# EasyEDA Pro project SOP100E 2025.05.27.eprj, schematic Schematic1, sheets 7 to 12 of 12

## Sheets
7 P7: Page Name: P7; Update Date: 2026-01-16
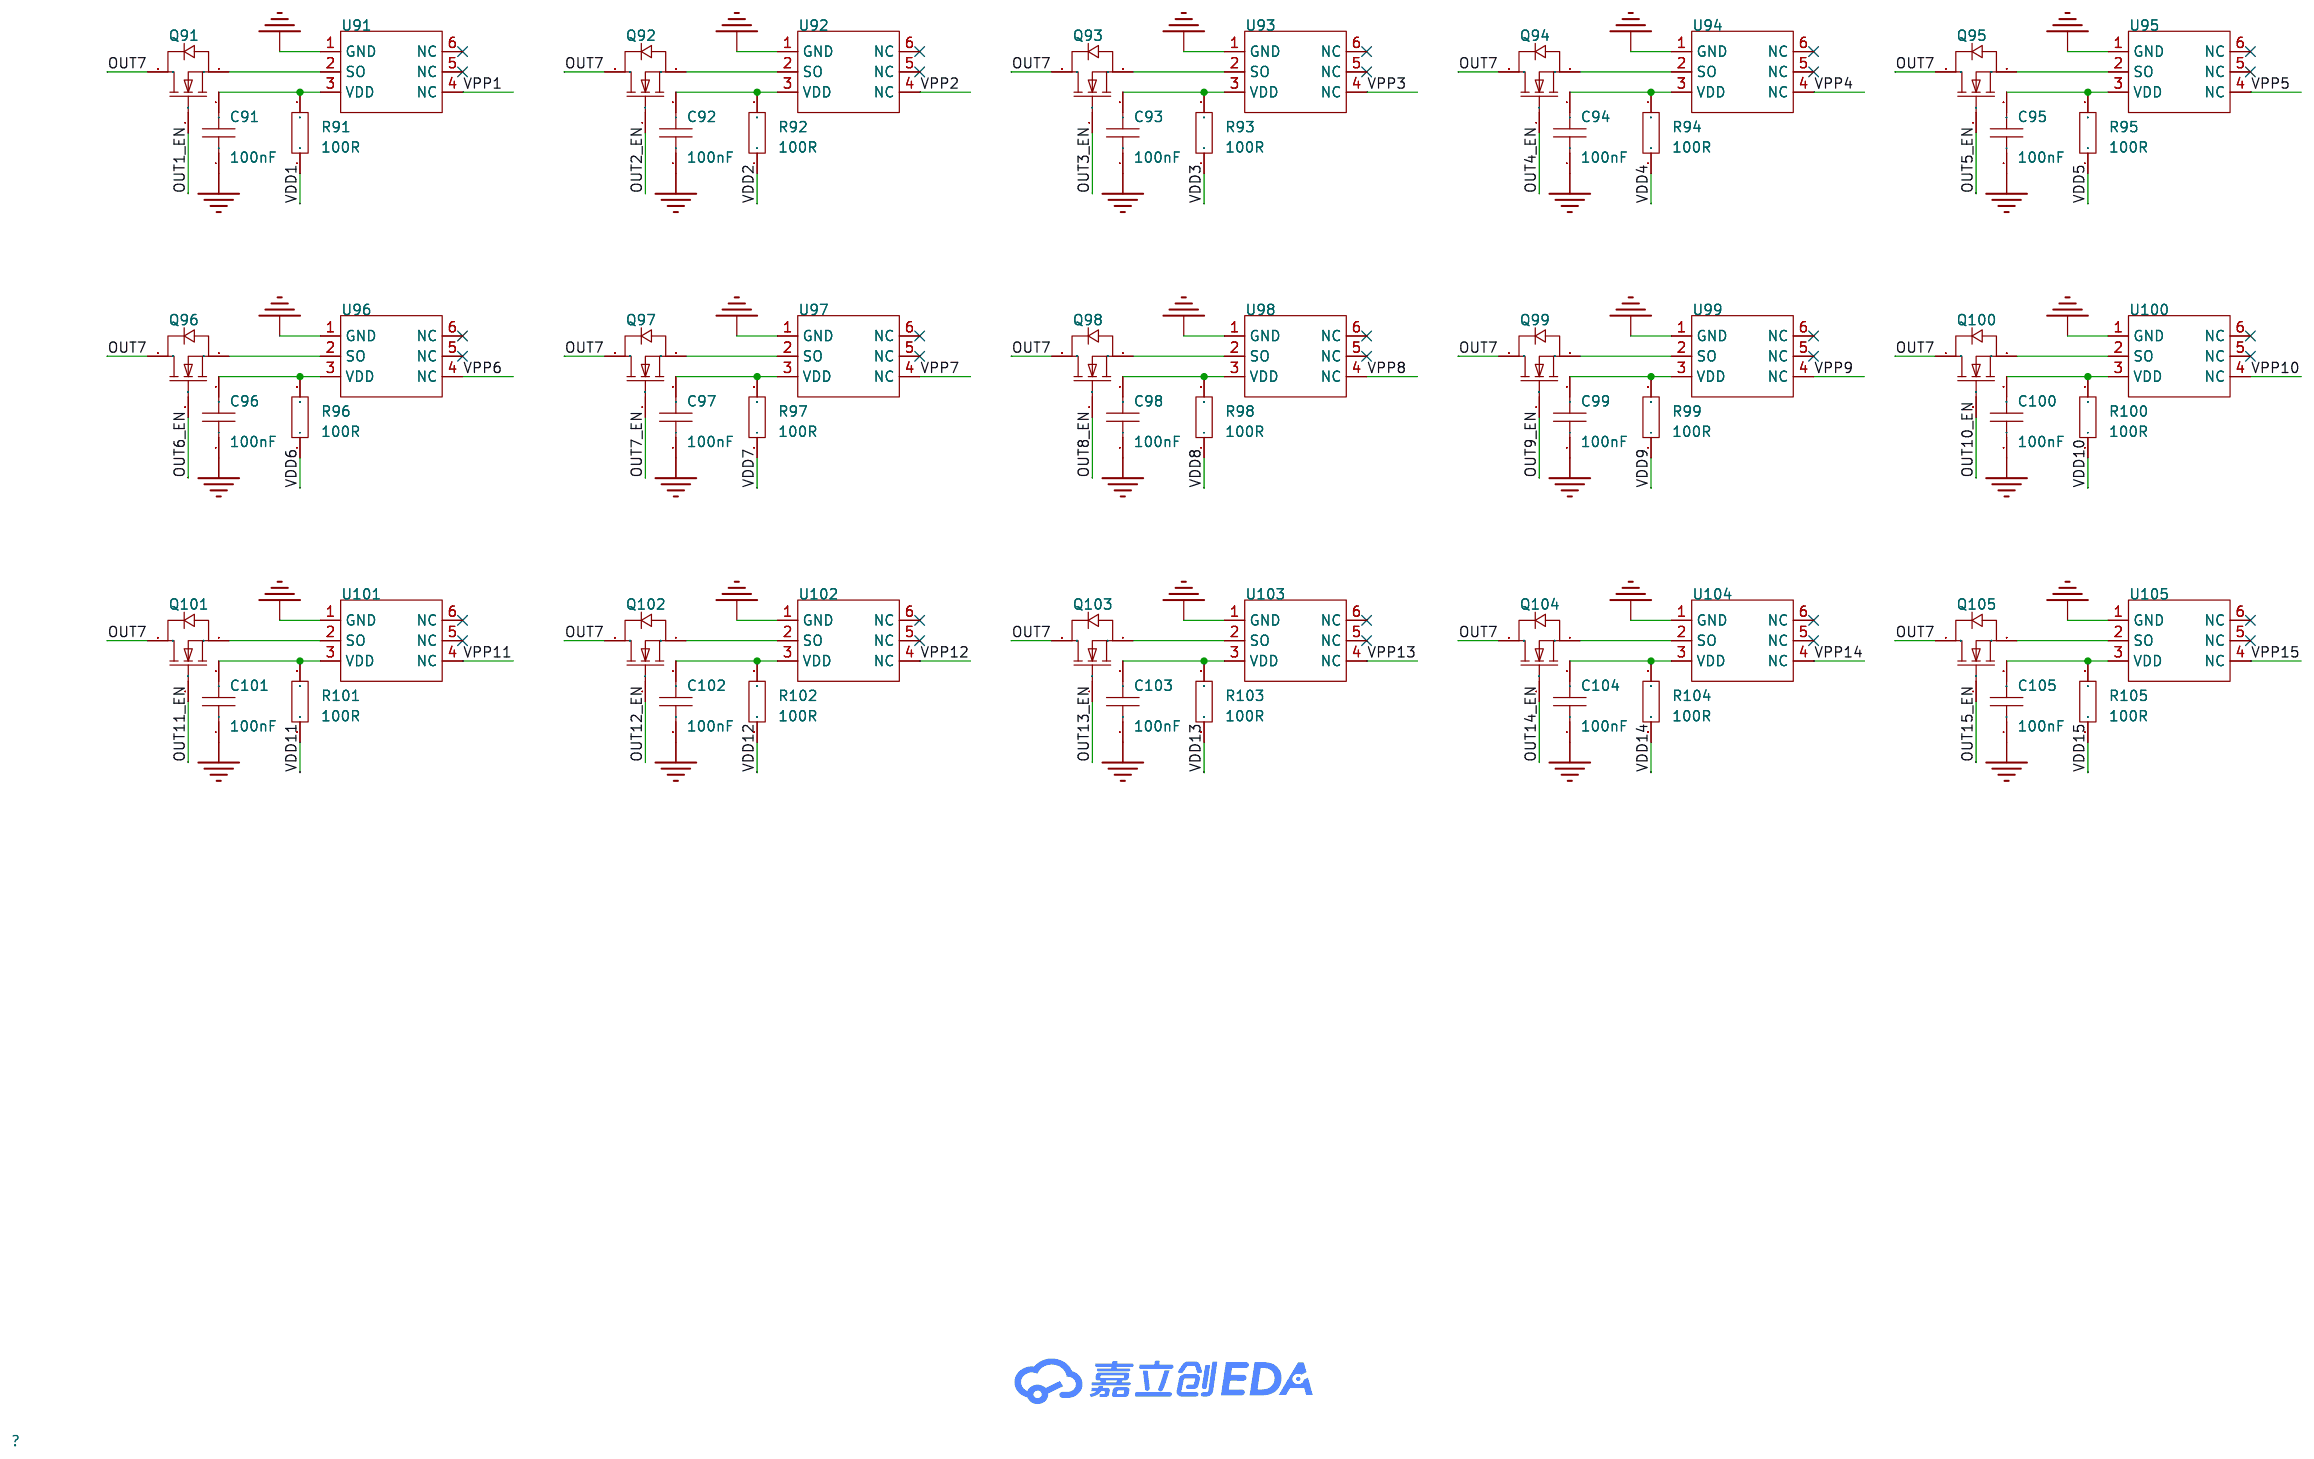
[diagram p6: P7]
8 P12: Create Date: 2026-01-15; Page Name: P12
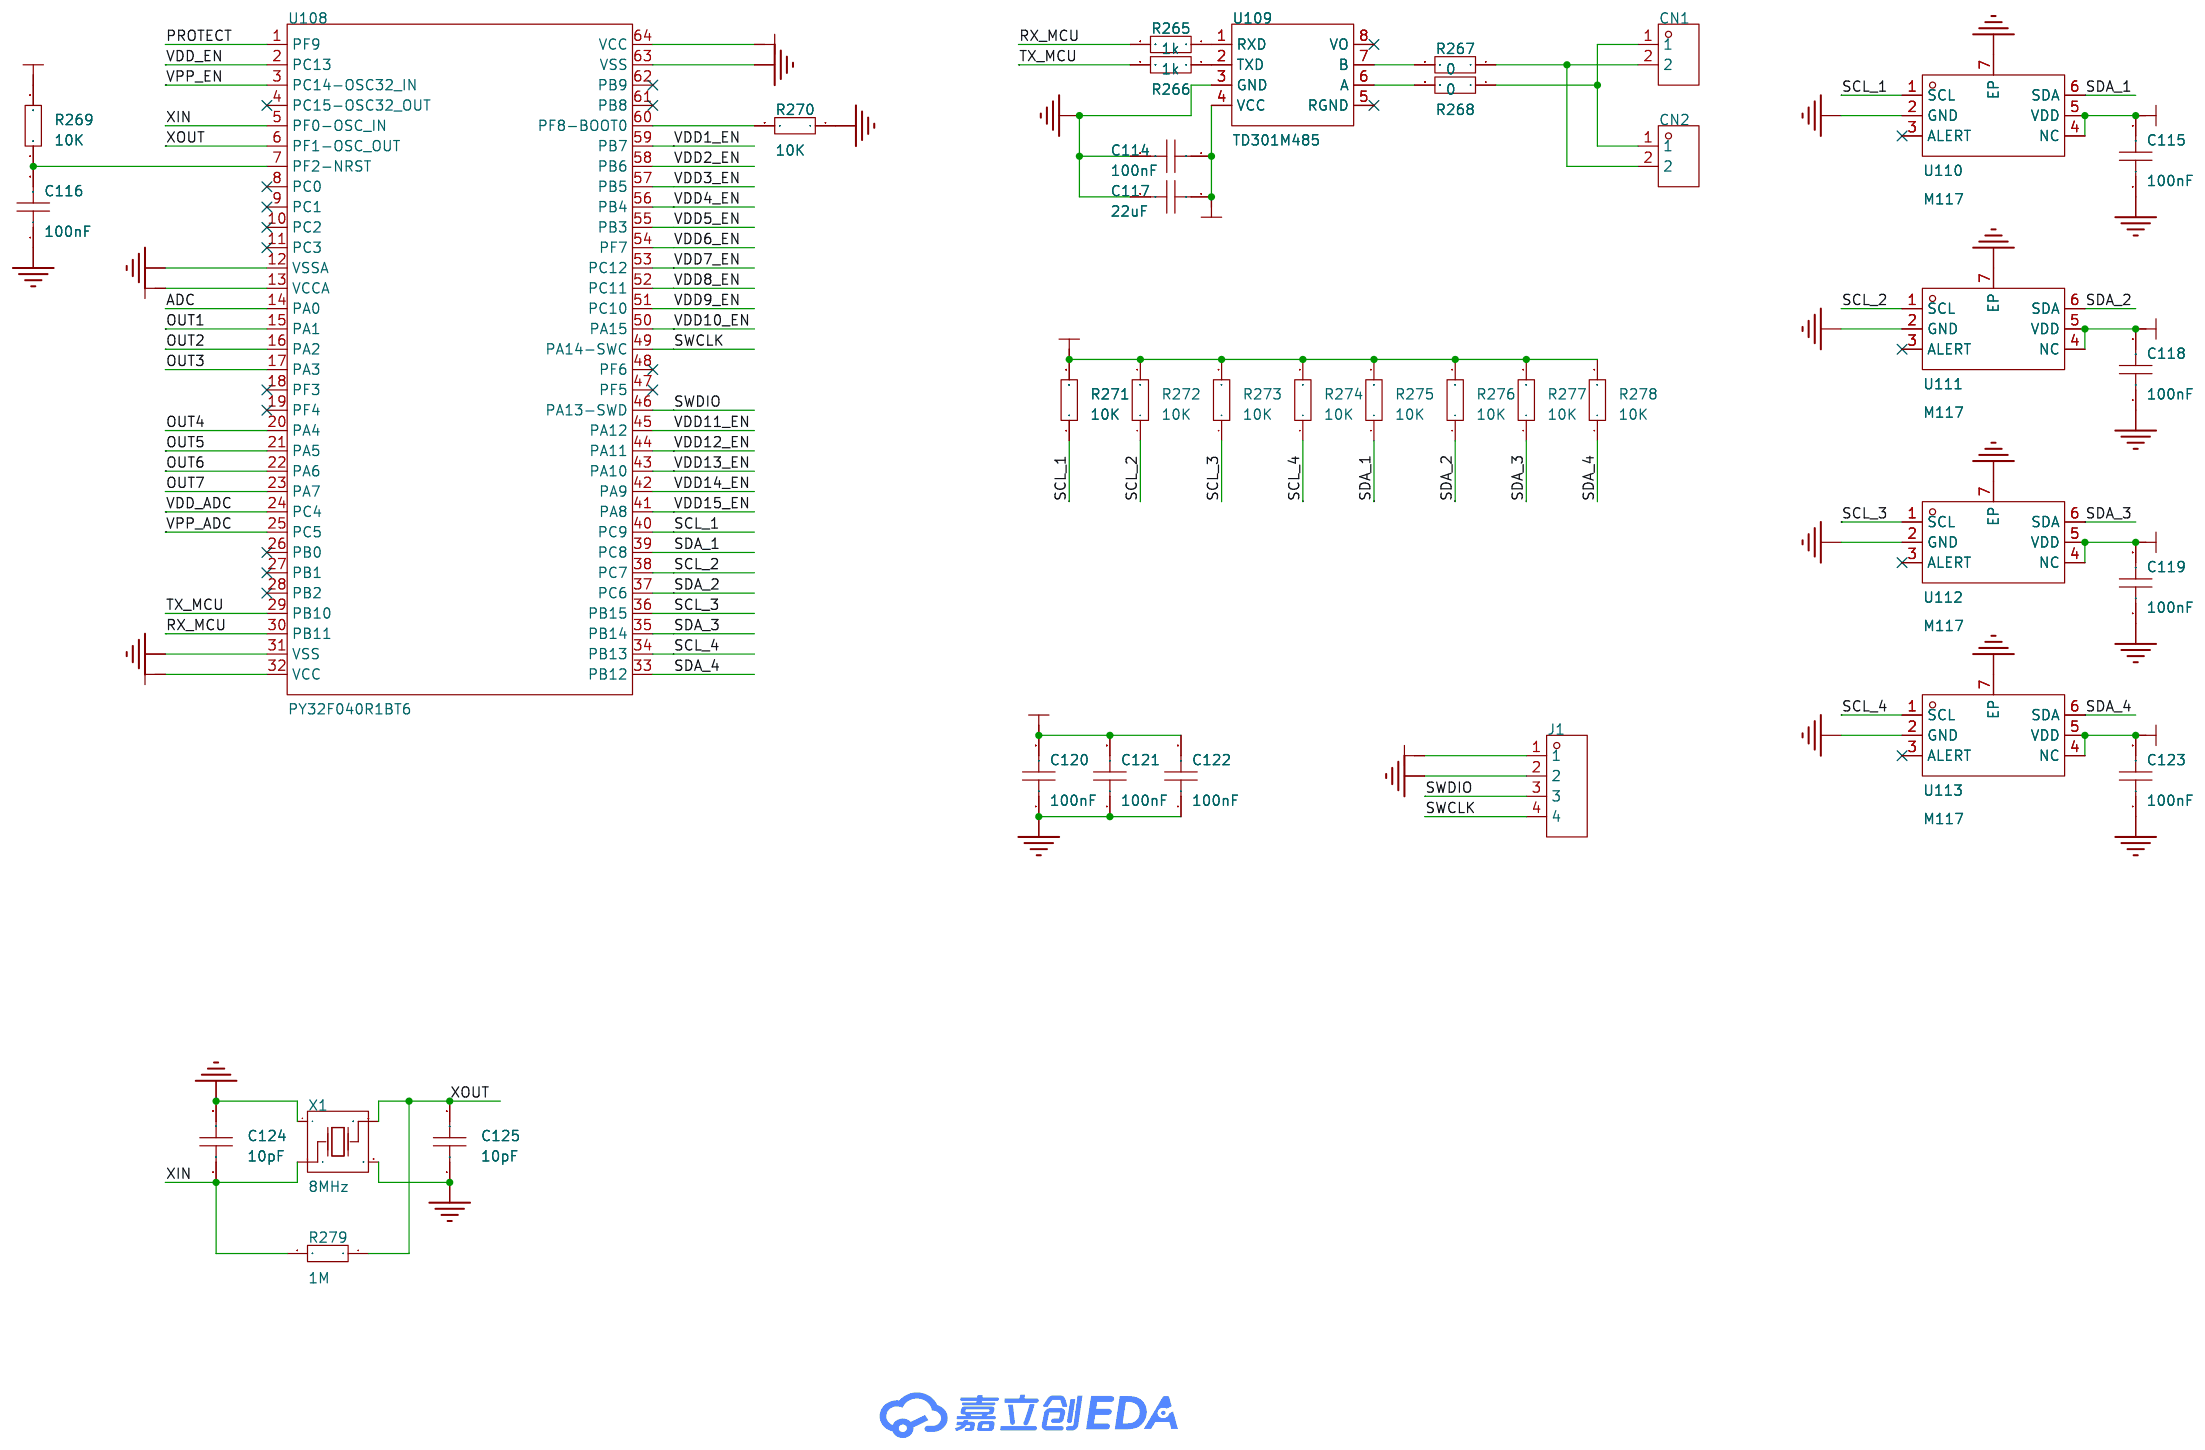
[diagram p7: P12]
9 P11: Create Date: 2026-01-15; Page Name: P11
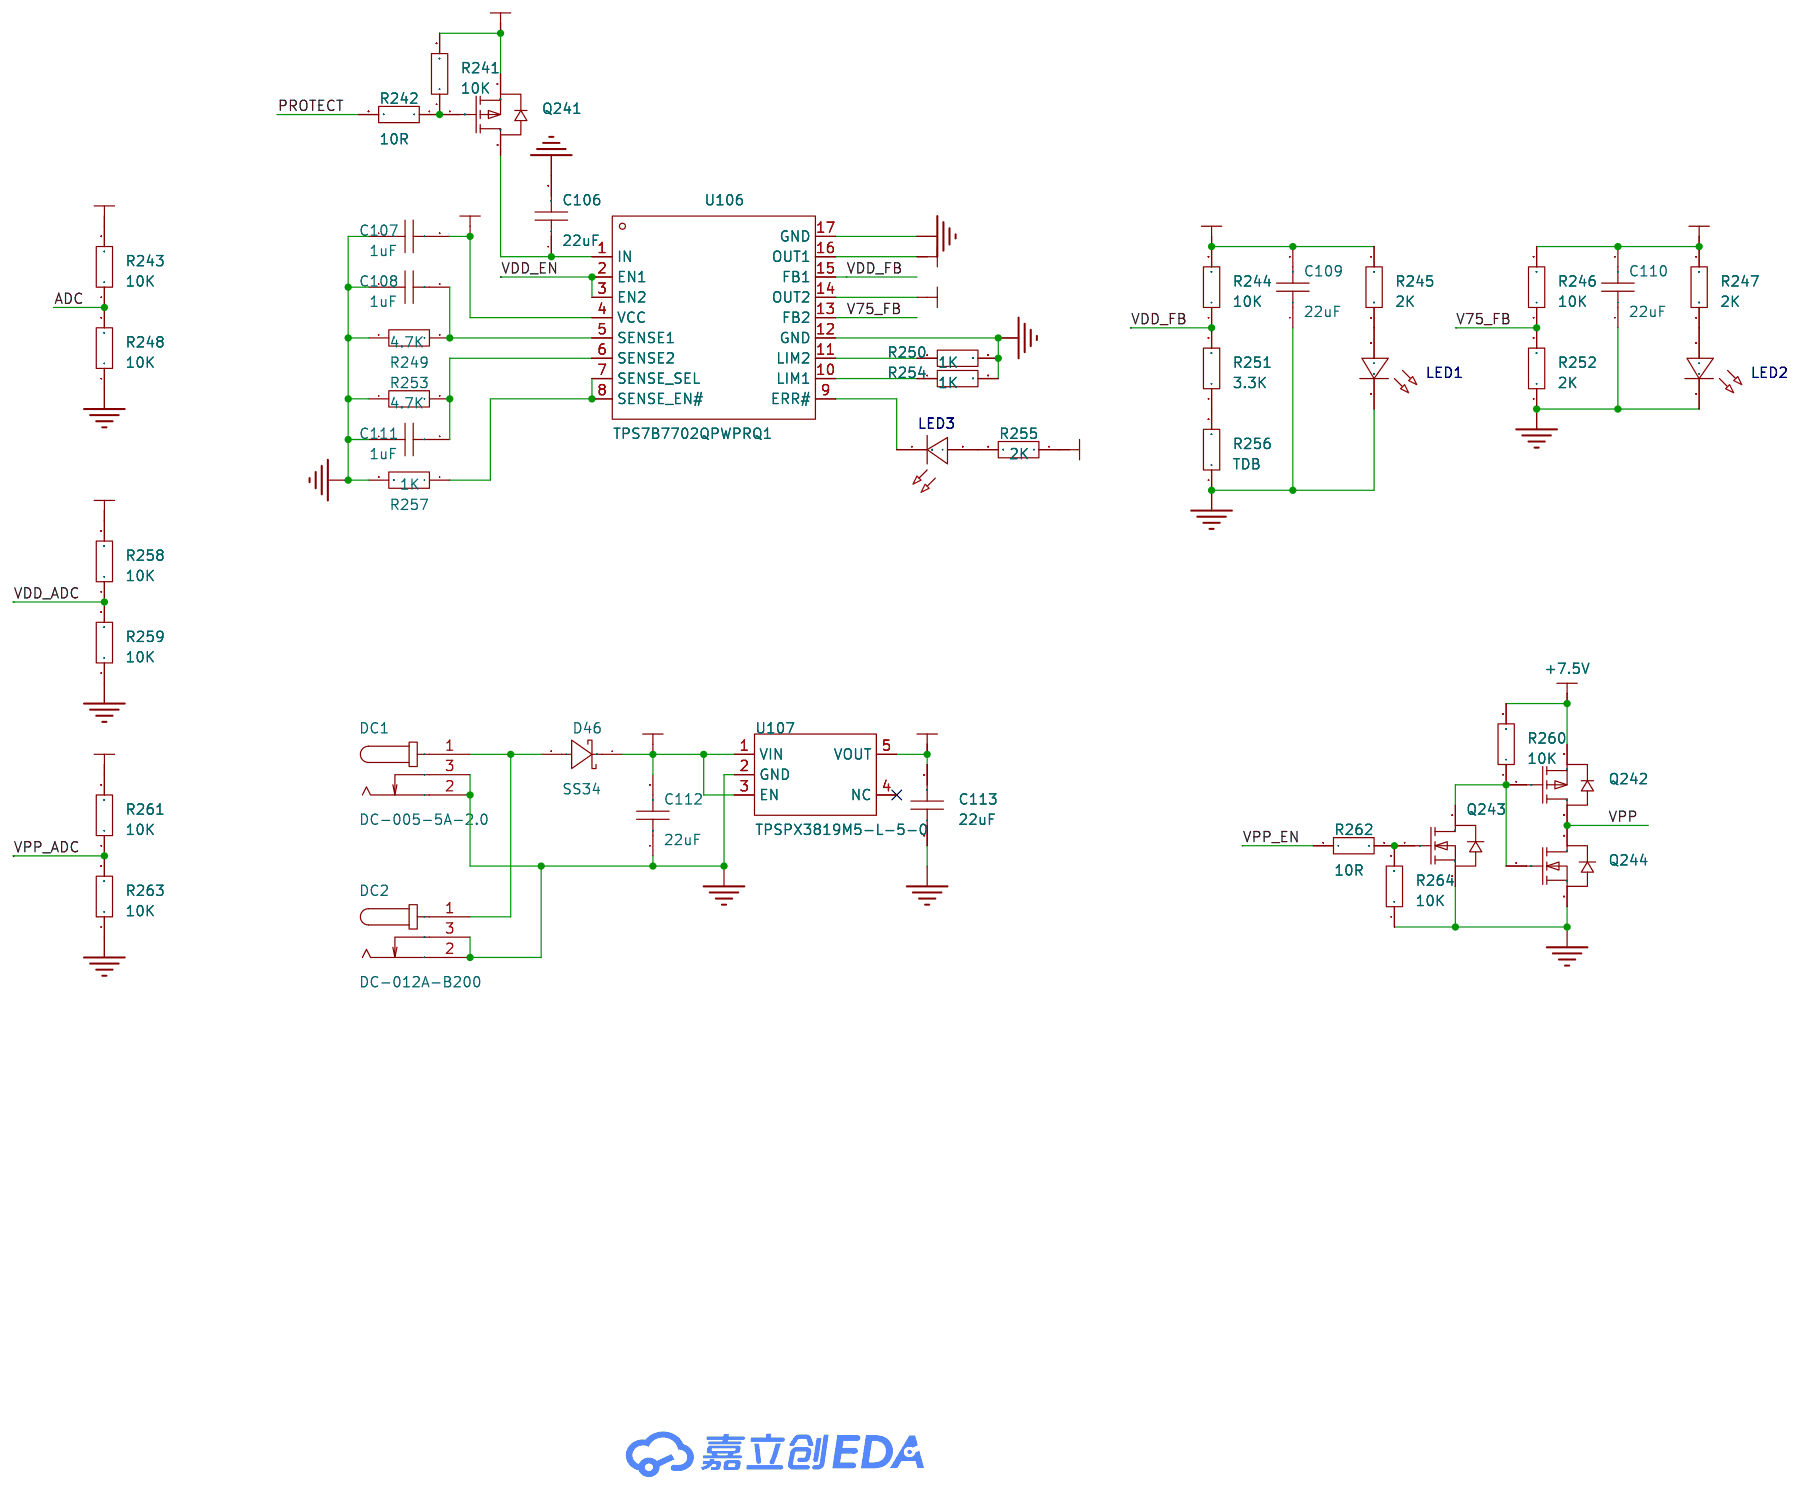
[diagram p8: P11]
10 P8: Create Date: 2026-01-15; Page Name: P8
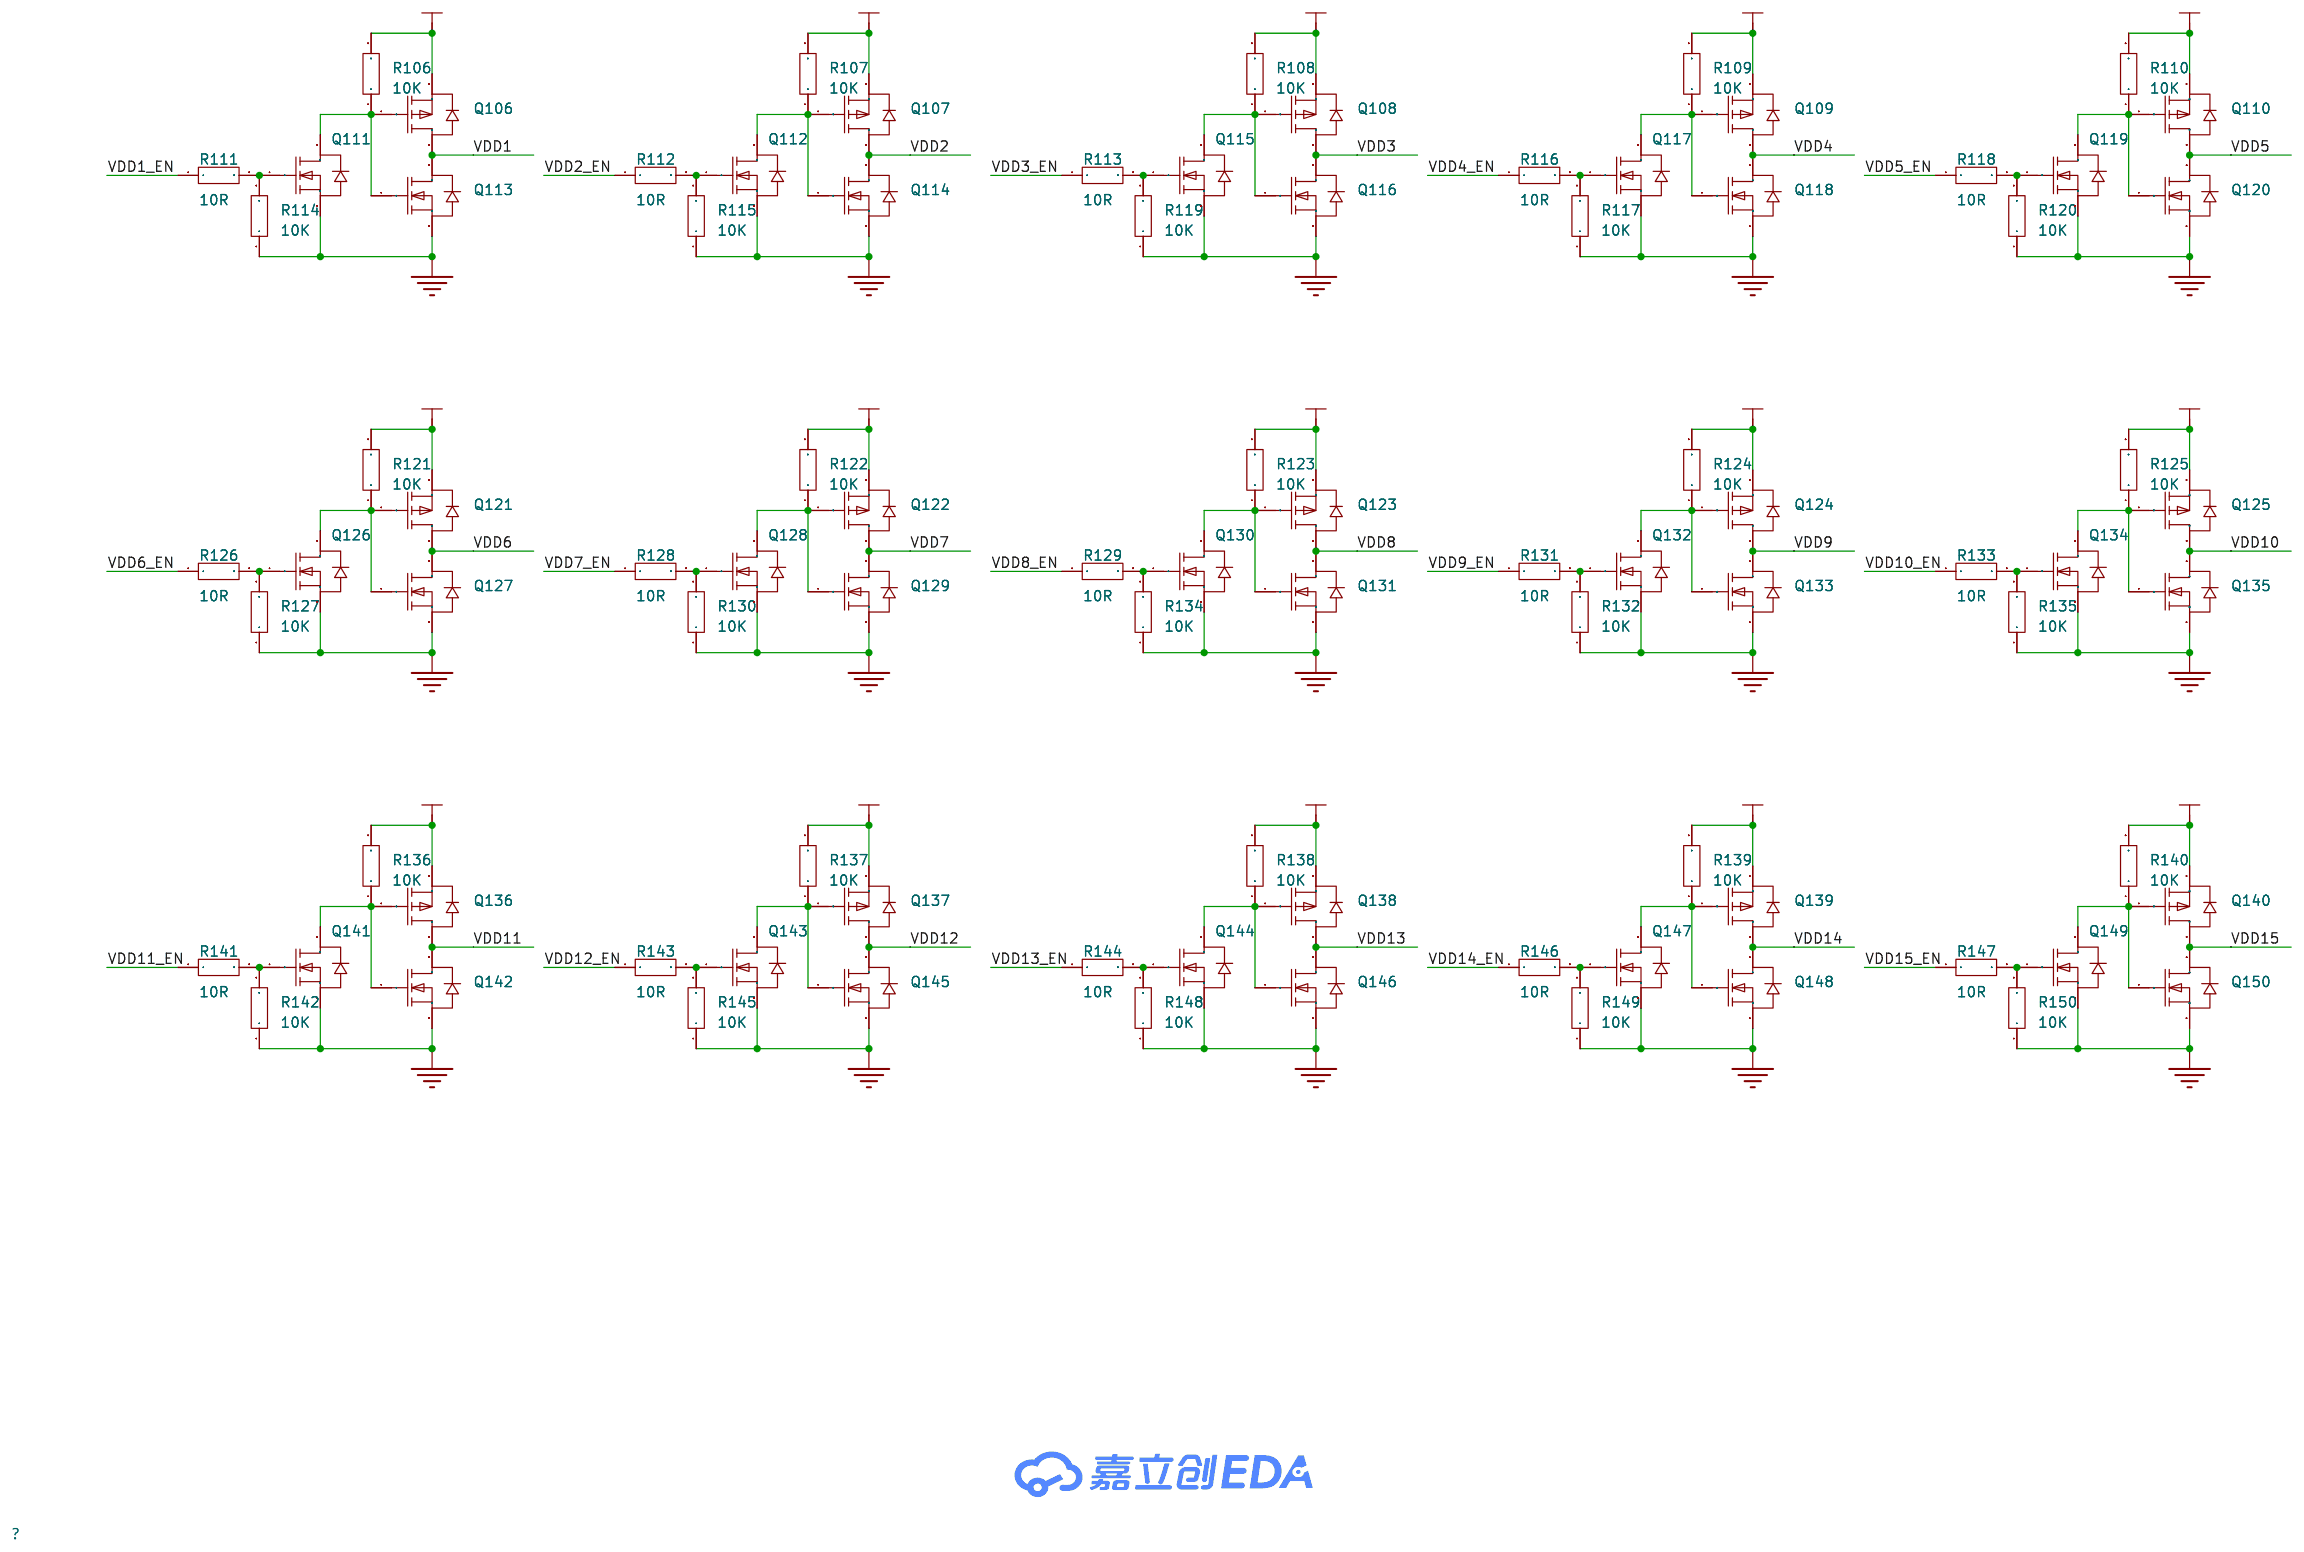
[diagram p9: P8]
11 P9: Create Date: 2026-01-16; Page Name: P9
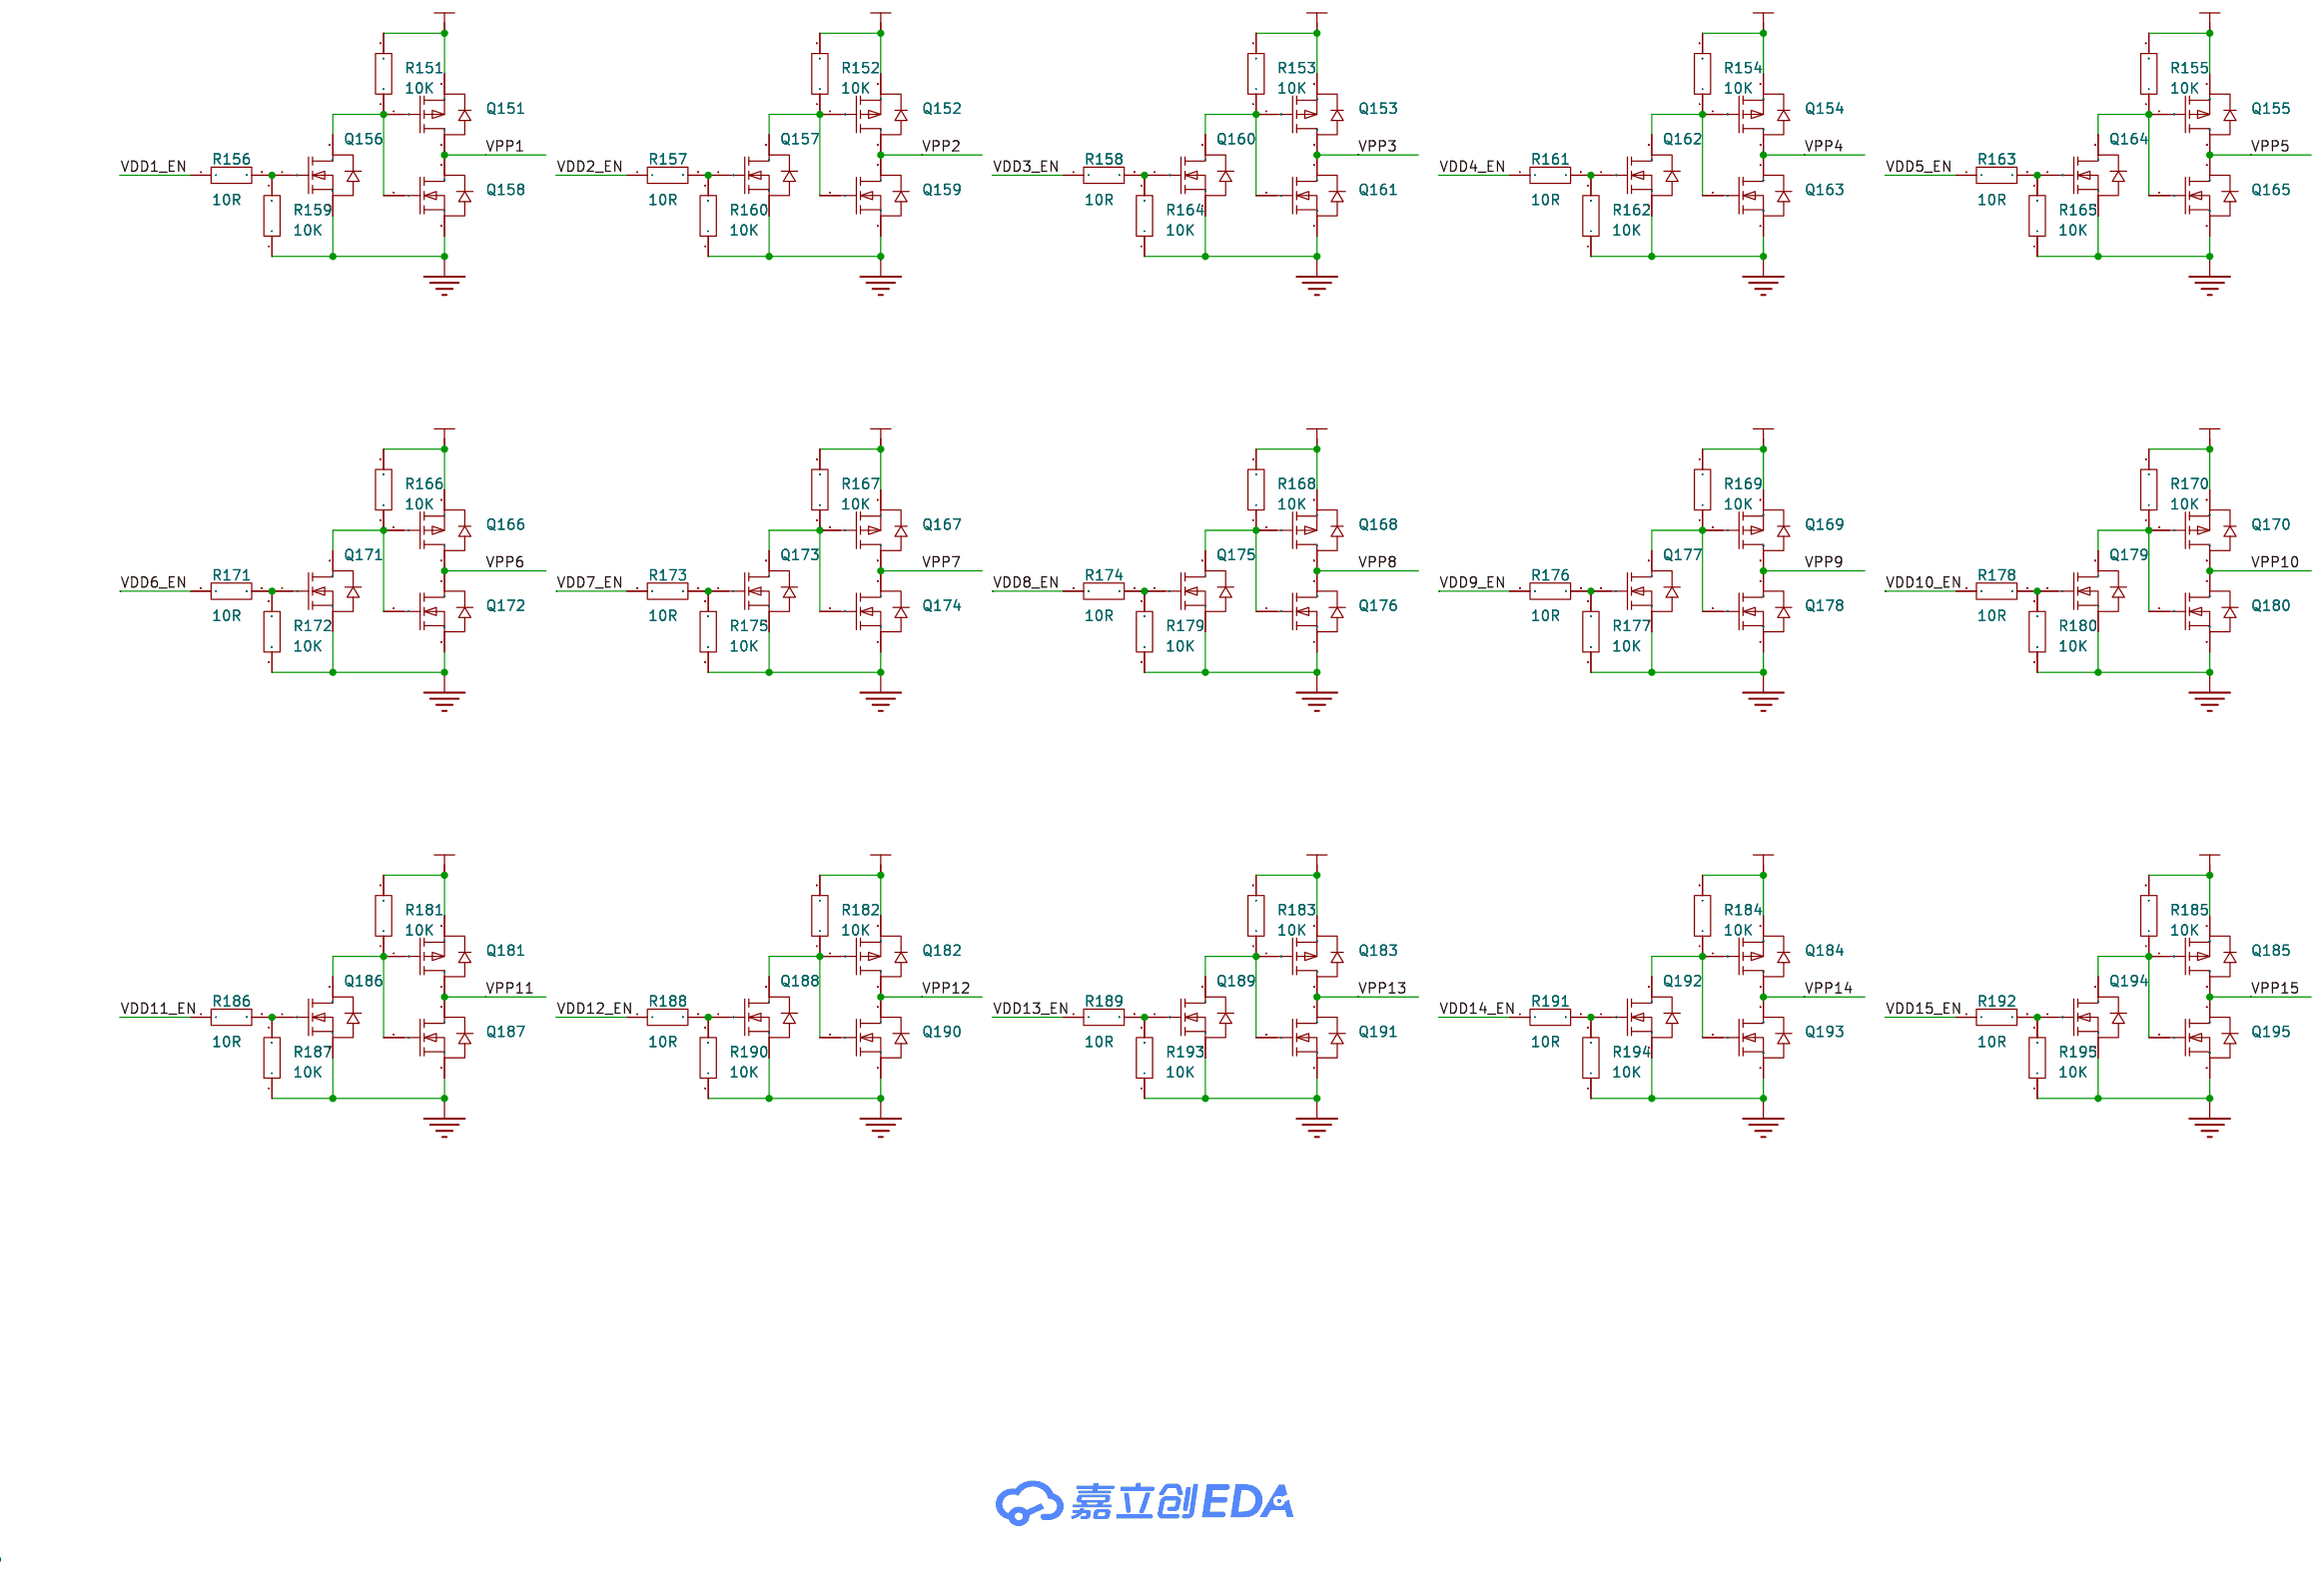
[diagram p10: P9]
12 P10: Create Date: 2026-01-16; Page Name: P10
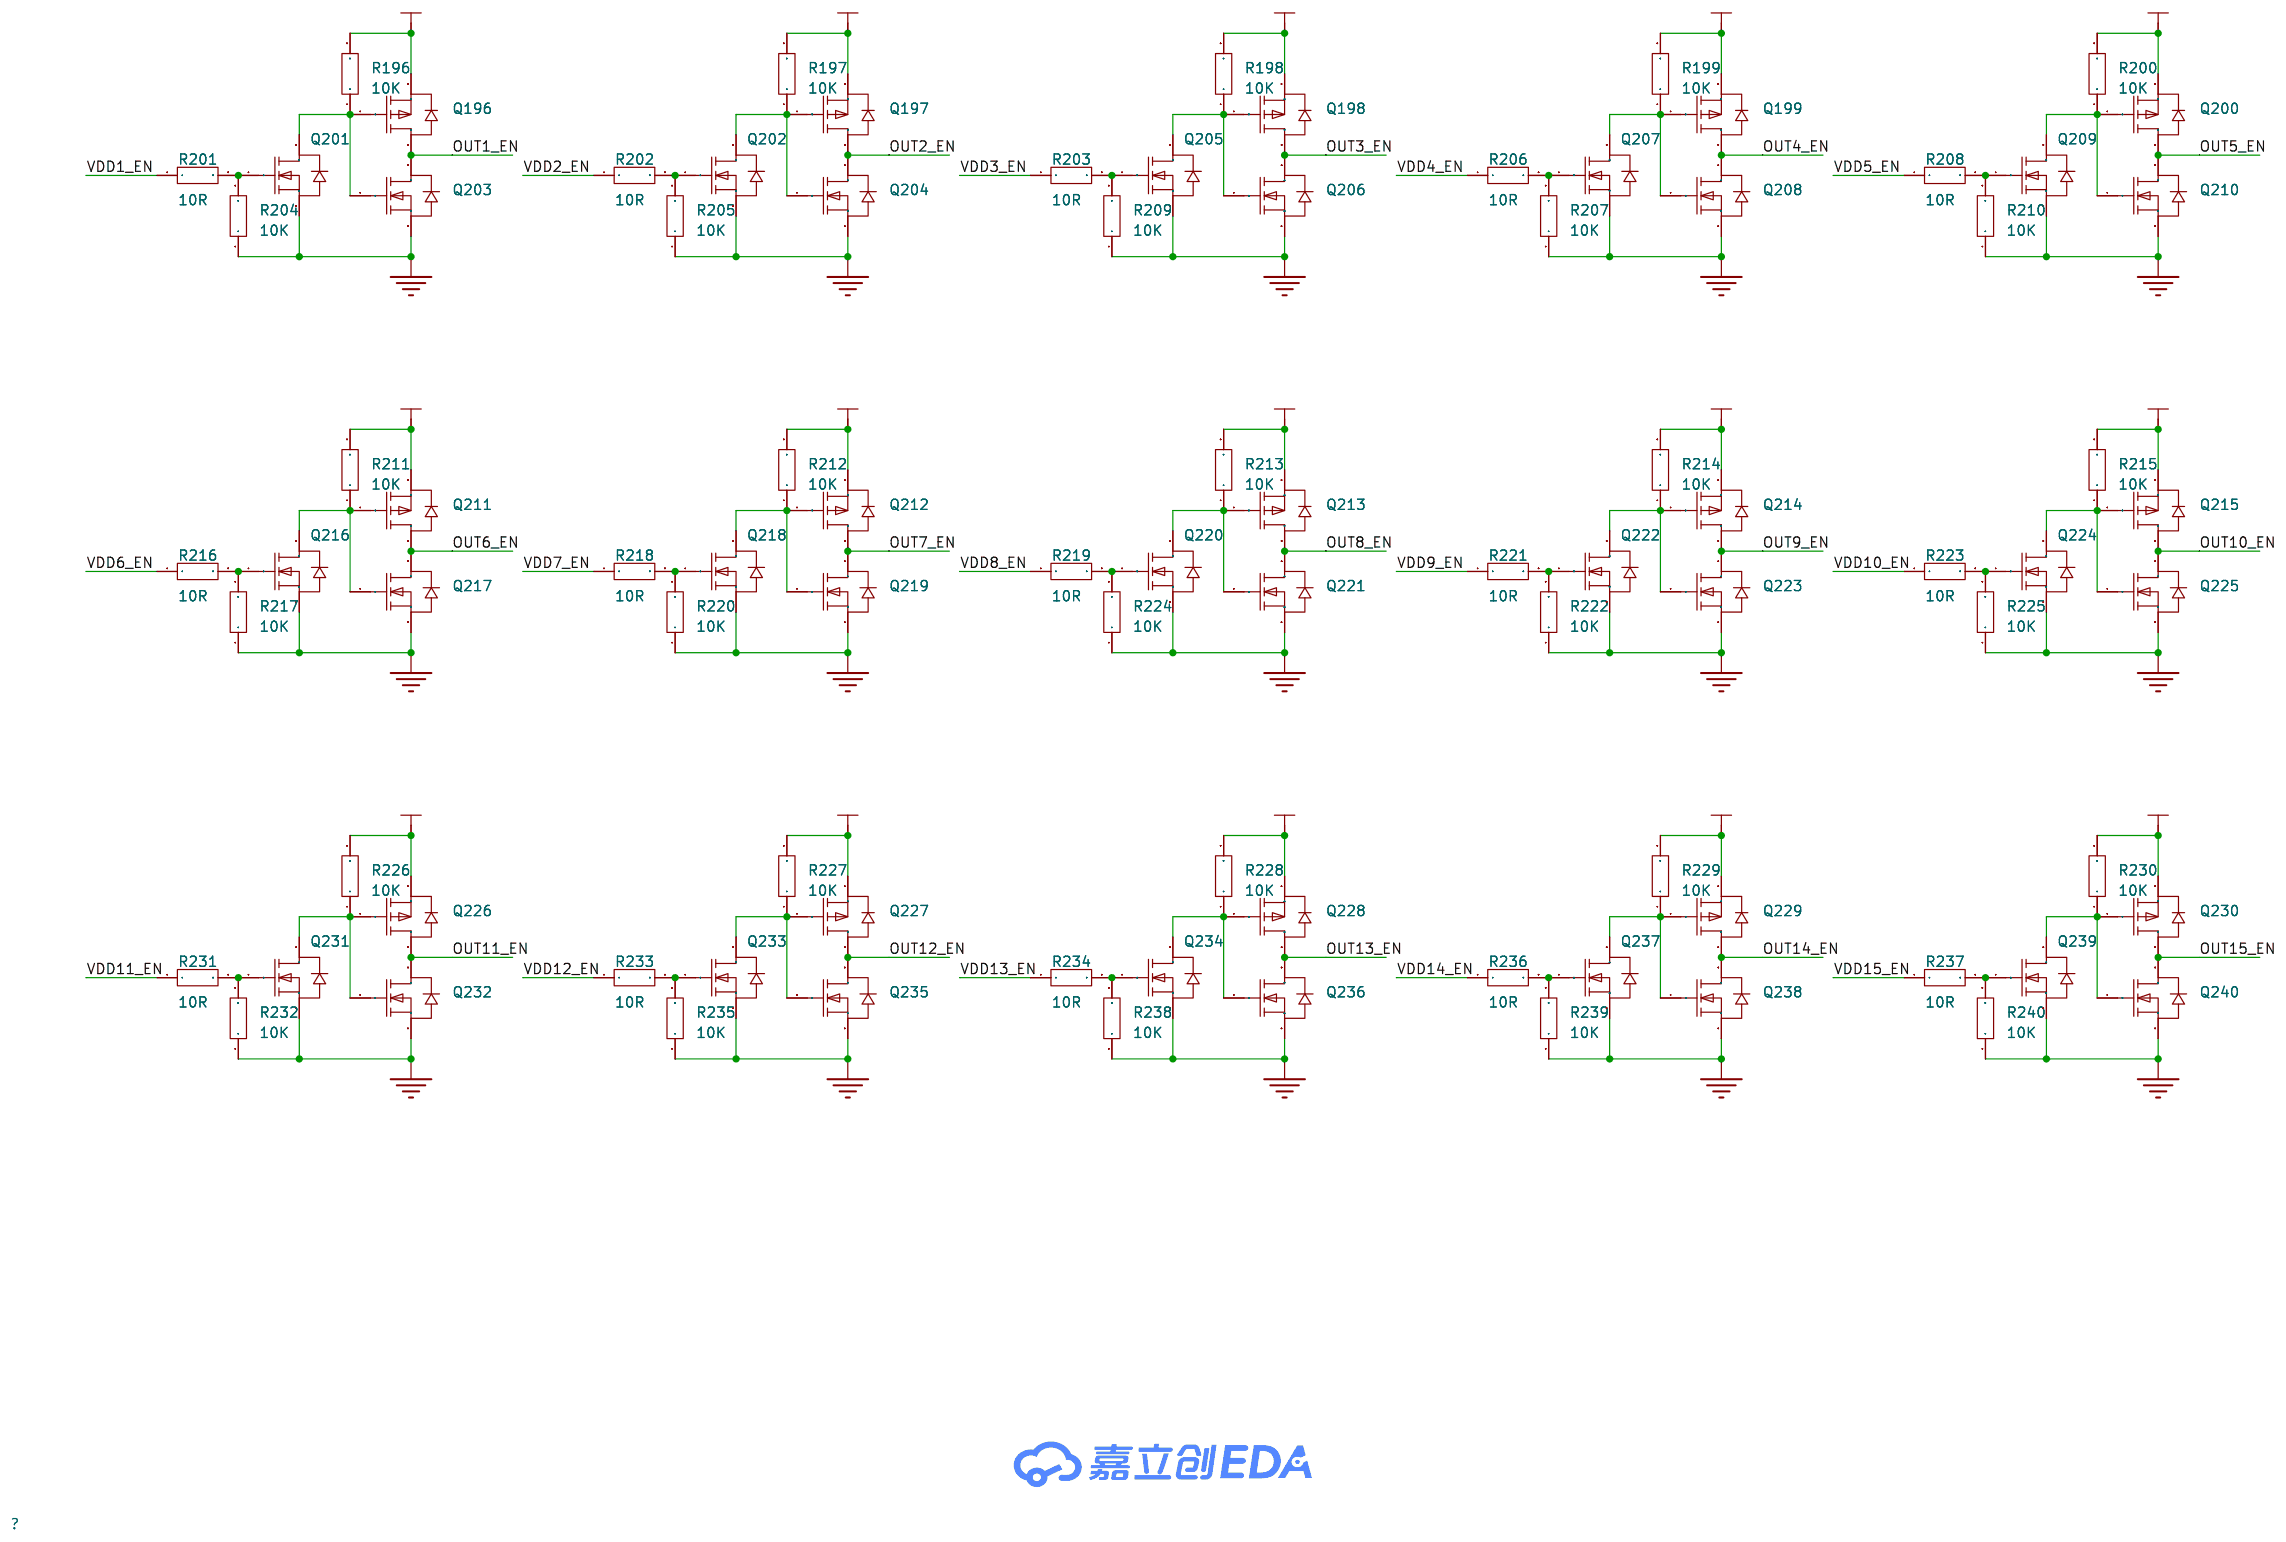
[diagram p11: P10]

## Parts
sheet P7
C91  100nF  [C0603]
C92  100nF  [C0603]
C93  100nF  [C0603]
C94  100nF  [C0603]
C95  100nF  [C0603]
C96  100nF  [C0603]
C97  100nF  [C0603]
C98  100nF  [C0603]
C99  100nF  [C0603]
C100  100nF  [C0603]
C101  100nF  [C0603]
C102  100nF  [C0603]
C103  100nF  [C0603]
C104  100nF  [C0603]
C105  100nF  [C0603]
Q91  AO3400A  [SOT-23-3_L2.9-W1.3-P1.90-LS2.4-BR]
Q92  AO3400A  [SOT-23-3_L2.9-W1.3-P1.90-LS2.4-BR]
Q93  AO3400A  [SOT-23-3_L2.9-W1.3-P1.90-LS2.4-BR]
Q94  AO3400A  [SOT-23-3_L2.9-W1.3-P1.90-LS2.4-BR]
Q95  AO3400A  [SOT-23-3_L2.9-W1.3-P1.90-LS2.4-BR]
Q96  AO3400A  [SOT-23-3_L2.9-W1.3-P1.90-LS2.4-BR]
Q97  AO3400A  [SOT-23-3_L2.9-W1.3-P1.90-LS2.4-BR]
Q98  AO3400A  [SOT-23-3_L2.9-W1.3-P1.90-LS2.4-BR]
Q99  AO3400A  [SOT-23-3_L2.9-W1.3-P1.90-LS2.4-BR]
Q100  AO3400A  [SOT-23-3_L2.9-W1.3-P1.90-LS2.4-BR]
Q101  AO3400A  [SOT-23-3_L2.9-W1.3-P1.90-LS2.4-BR]
Q102  AO3400A  [SOT-23-3_L2.9-W1.3-P1.90-LS2.4-BR]
Q103  AO3400A  [SOT-23-3_L2.9-W1.3-P1.90-LS2.4-BR]
Q104  AO3400A  [SOT-23-3_L2.9-W1.3-P1.90-LS2.4-BR]
Q105  AO3400A  [SOT-23-3_L2.9-W1.3-P1.90-LS2.4-BR]
R91  100R  [R0603]
R92  100R  [R0603]
R93  100R  [R0603]
R94  100R  [R0603]
R95  100R  [R0603]
R96  100R  [R0603]
R97  100R  [R0603]
R98  100R  [R0603]
R99  100R  [R0603]
R100  100R  [R0603]
R101  100R  [R0603]
R102  100R  [R0603]
R103  100R  [R0603]
R104  100R  [R0603]
R105  100R  [R0603]
U91  WF100E 1BG S6 DA 0.5P4.5 AT  [SOP-6_L7.0-W7.0-P2.54-LS10.3-TL-CW]
U92  WF100E 1BG S6 DA 0.5P4.5 AT  [SOP-6_L7.0-W7.0-P2.54-LS10.3-TL-CW]
U93  WF100E 1BG S6 DA 0.5P4.5 AT  [SOP-6_L7.0-W7.0-P2.54-LS10.3-TL-CW]
U94  WF100E 1BG S6 DA 0.5P4.5 AT  [SOP-6_L7.0-W7.0-P2.54-LS10.3-TL-CW]
U95  WF100E 1BG S6 DA 0.5P4.5 AT  [SOP-6_L7.0-W7.0-P2.54-LS10.3-TL-CW]
U96  WF100E 1BG S6 DA 0.5P4.5 AT  [SOP-6_L7.0-W7.0-P2.54-LS10.3-TL-CW]
U97  WF100E 1BG S6 DA 0.5P4.5 AT  [SOP-6_L7.0-W7.0-P2.54-LS10.3-TL-CW]
U98  WF100E 1BG S6 DA 0.5P4.5 AT  [SOP-6_L7.0-W7.0-P2.54-LS10.3-TL-CW]
U99  WF100E 1BG S6 DA 0.5P4.5 AT  [SOP-6_L7.0-W7.0-P2.54-LS10.3-TL-CW]
U100  WF100E 1BG S6 DA 0.5P4.5 AT  [SOP-6_L7.0-W7.0-P2.54-LS10.3-TL-CW]
U101  WF100E 1BG S6 DA 0.5P4.5 AT  [SOP-6_L7.0-W7.0-P2.54-LS10.3-TL-CW]
U102  WF100E 1BG S6 DA 0.5P4.5 AT  [SOP-6_L7.0-W7.0-P2.54-LS10.3-TL-CW]
U103  WF100E 1BG S6 DA 0.5P4.5 AT  [SOP-6_L7.0-W7.0-P2.54-LS10.3-TL-CW]
U104  WF100E 1BG S6 DA 0.5P4.5 AT  [SOP-6_L7.0-W7.0-P2.54-LS10.3-TL-CW]
U105  WF100E 1BG S6 DA 0.5P4.5 AT  [SOP-6_L7.0-W7.0-P2.54-LS10.3-TL-CW]
sheet P8
Q106  AO3401A  [SOT-23_L2.9-W1.3-P1.90-LS2.4-BR]
Q107  AO3401A  [SOT-23_L2.9-W1.3-P1.90-LS2.4-BR]
Q108  AO3401A  [SOT-23_L2.9-W1.3-P1.90-LS2.4-BR]
Q109  AO3401A  [SOT-23_L2.9-W1.3-P1.90-LS2.4-BR]
Q110  AO3401A  [SOT-23_L2.9-W1.3-P1.90-LS2.4-BR]
Q111  AO3400A  [SOT-23-3_L2.9-W1.3-P1.90-LS2.4-BR]
Q112  AO3400A  [SOT-23-3_L2.9-W1.3-P1.90-LS2.4-BR]
Q113  AO3400A  [SOT-23-3_L2.9-W1.3-P1.90-LS2.4-BR]
Q114  AO3400A  [SOT-23-3_L2.9-W1.3-P1.90-LS2.4-BR]
Q115  AO3400A  [SOT-23-3_L2.9-W1.3-P1.90-LS2.4-BR]
Q116  AO3400A  [SOT-23-3_L2.9-W1.3-P1.90-LS2.4-BR]
Q117  AO3400A  [SOT-23-3_L2.9-W1.3-P1.90-LS2.4-BR]
Q118  AO3400A  [SOT-23-3_L2.9-W1.3-P1.90-LS2.4-BR]
Q119  AO3400A  [SOT-23-3_L2.9-W1.3-P1.90-LS2.4-BR]
Q120  AO3400A  [SOT-23-3_L2.9-W1.3-P1.90-LS2.4-BR]
Q121  AO3401A  [SOT-23_L2.9-W1.3-P1.90-LS2.4-BR]
Q122  AO3401A  [SOT-23_L2.9-W1.3-P1.90-LS2.4-BR]
Q123  AO3401A  [SOT-23_L2.9-W1.3-P1.90-LS2.4-BR]
Q124  AO3401A  [SOT-23_L2.9-W1.3-P1.90-LS2.4-BR]
Q125  AO3401A  [SOT-23_L2.9-W1.3-P1.90-LS2.4-BR]
Q126  AO3400A  [SOT-23-3_L2.9-W1.3-P1.90-LS2.4-BR]
Q127  AO3400A  [SOT-23-3_L2.9-W1.3-P1.90-LS2.4-BR]
Q128  AO3400A  [SOT-23-3_L2.9-W1.3-P1.90-LS2.4-BR]
Q129  AO3400A  [SOT-23-3_L2.9-W1.3-P1.90-LS2.4-BR]
Q130  AO3400A  [SOT-23-3_L2.9-W1.3-P1.90-LS2.4-BR]
Q131  AO3400A  [SOT-23-3_L2.9-W1.3-P1.90-LS2.4-BR]
Q132  AO3400A  [SOT-23-3_L2.9-W1.3-P1.90-LS2.4-BR]
Q133  AO3400A  [SOT-23-3_L2.9-W1.3-P1.90-LS2.4-BR]
Q134  AO3400A  [SOT-23-3_L2.9-W1.3-P1.90-LS2.4-BR]
Q135  AO3400A  [SOT-23-3_L2.9-W1.3-P1.90-LS2.4-BR]
Q136  AO3401A  [SOT-23_L2.9-W1.3-P1.90-LS2.4-BR]
Q137  AO3401A  [SOT-23_L2.9-W1.3-P1.90-LS2.4-BR]
Q138  AO3401A  [SOT-23_L2.9-W1.3-P1.90-LS2.4-BR]
Q139  AO3401A  [SOT-23_L2.9-W1.3-P1.90-LS2.4-BR]
Q140  AO3401A  [SOT-23_L2.9-W1.3-P1.90-LS2.4-BR]
Q141  AO3400A  [SOT-23-3_L2.9-W1.3-P1.90-LS2.4-BR]
Q142  AO3400A  [SOT-23-3_L2.9-W1.3-P1.90-LS2.4-BR]
Q143  AO3400A  [SOT-23-3_L2.9-W1.3-P1.90-LS2.4-BR]
Q144  AO3400A  [SOT-23-3_L2.9-W1.3-P1.90-LS2.4-BR]
Q145  AO3400A  [SOT-23-3_L2.9-W1.3-P1.90-LS2.4-BR]
Q146  AO3400A  [SOT-23-3_L2.9-W1.3-P1.90-LS2.4-BR]
Q147  AO3400A  [SOT-23-3_L2.9-W1.3-P1.90-LS2.4-BR]
Q148  AO3400A  [SOT-23-3_L2.9-W1.3-P1.90-LS2.4-BR]
Q149  AO3400A  [SOT-23-3_L2.9-W1.3-P1.90-LS2.4-BR]
Q150  AO3400A  [SOT-23-3_L2.9-W1.3-P1.90-LS2.4-BR]
R106  10K  [R0603]
R107  10K  [R0603]
R108  10K  [R0603]
R109  10K  [R0603]
R110  10K  [R0603]
R111  10R  [R0603]
R112  10R  [R0603]
R113  10R  [R0603]
R114  10K  [R0603]
R115  10K  [R0603]
R116  10R  [R0603]
R117  10K  [R0603]
R118  10R  [R0603]
R119  10K  [R0603]
R120  10K  [R0603]
R121  10K  [R0603]
R122  10K  [R0603]
R123  10K  [R0603]
R124  10K  [R0603]
R125  10K  [R0603]
R126  10R  [R0603]
R127  10K  [R0603]
R128  10R  [R0603]
R129  10R  [R0603]
R130  10K  [R0603]
R131  10R  [R0603]
R132  10K  [R0603]
R133  10R  [R0603]
R134  10K  [R0603]
R135  10K  [R0603]
R136  10K  [R0603]
R137  10K  [R0603]
R138  10K  [R0603]
R139  10K  [R0603]
R140  10K  [R0603]
R141  10R  [R0603]
R142  10K  [R0603]
R143  10R  [R0603]
R144  10R  [R0603]
R145  10K  [R0603]
R146  10R  [R0603]
R147  10R  [R0603]
R148  10K  [R0603]
R149  10K  [R0603]
R150  10K  [R0603]
sheet P9
Q151  AO3401A  [SOT-23_L2.9-W1.3-P1.90-LS2.4-BR]
Q152  AO3401A  [SOT-23_L2.9-W1.3-P1.90-LS2.4-BR]
Q153  AO3401A  [SOT-23_L2.9-W1.3-P1.90-LS2.4-BR]
Q154  AO3401A  [SOT-23_L2.9-W1.3-P1.90-LS2.4-BR]
Q155  AO3401A  [SOT-23_L2.9-W1.3-P1.90-LS2.4-BR]
Q156  AO3400A  [SOT-23-3_L2.9-W1.3-P1.90-LS2.4-BR]
Q157  AO3400A  [SOT-23-3_L2.9-W1.3-P1.90-LS2.4-BR]
Q158  AO3400A  [SOT-23-3_L2.9-W1.3-P1.90-LS2.4-BR]
Q159  AO3400A  [SOT-23-3_L2.9-W1.3-P1.90-LS2.4-BR]
Q160  AO3400A  [SOT-23-3_L2.9-W1.3-P1.90-LS2.4-BR]
Q161  AO3400A  [SOT-23-3_L2.9-W1.3-P1.90-LS2.4-BR]
Q162  AO3400A  [SOT-23-3_L2.9-W1.3-P1.90-LS2.4-BR]
Q163  AO3400A  [SOT-23-3_L2.9-W1.3-P1.90-LS2.4-BR]
Q164  AO3400A  [SOT-23-3_L2.9-W1.3-P1.90-LS2.4-BR]
Q165  AO3400A  [SOT-23-3_L2.9-W1.3-P1.90-LS2.4-BR]
Q166  AO3401A  [SOT-23_L2.9-W1.3-P1.90-LS2.4-BR]
Q167  AO3401A  [SOT-23_L2.9-W1.3-P1.90-LS2.4-BR]
Q168  AO3401A  [SOT-23_L2.9-W1.3-P1.90-LS2.4-BR]
Q169  AO3401A  [SOT-23_L2.9-W1.3-P1.90-LS2.4-BR]
Q170  AO3401A  [SOT-23_L2.9-W1.3-P1.90-LS2.4-BR]
Q171  AO3400A  [SOT-23-3_L2.9-W1.3-P1.90-LS2.4-BR]
Q172  AO3400A  [SOT-23-3_L2.9-W1.3-P1.90-LS2.4-BR]
Q173  AO3400A  [SOT-23-3_L2.9-W1.3-P1.90-LS2.4-BR]
Q174  AO3400A  [SOT-23-3_L2.9-W1.3-P1.90-LS2.4-BR]
Q175  AO3400A  [SOT-23-3_L2.9-W1.3-P1.90-LS2.4-BR]
Q176  AO3400A  [SOT-23-3_L2.9-W1.3-P1.90-LS2.4-BR]
Q177  AO3400A  [SOT-23-3_L2.9-W1.3-P1.90-LS2.4-BR]
Q178  AO3400A  [SOT-23-3_L2.9-W1.3-P1.90-LS2.4-BR]
Q179  AO3400A  [SOT-23-3_L2.9-W1.3-P1.90-LS2.4-BR]
Q180  AO3400A  [SOT-23-3_L2.9-W1.3-P1.90-LS2.4-BR]
Q181  AO3401A  [SOT-23_L2.9-W1.3-P1.90-LS2.4-BR]
Q182  AO3401A  [SOT-23_L2.9-W1.3-P1.90-LS2.4-BR]
Q183  AO3401A  [SOT-23_L2.9-W1.3-P1.90-LS2.4-BR]
Q184  AO3401A  [SOT-23_L2.9-W1.3-P1.90-LS2.4-BR]
Q185  AO3401A  [SOT-23_L2.9-W1.3-P1.90-LS2.4-BR]
Q186  AO3400A  [SOT-23-3_L2.9-W1.3-P1.90-LS2.4-BR]
Q187  AO3400A  [SOT-23-3_L2.9-W1.3-P1.90-LS2.4-BR]
Q188  AO3400A  [SOT-23-3_L2.9-W1.3-P1.90-LS2.4-BR]
Q189  AO3400A  [SOT-23-3_L2.9-W1.3-P1.90-LS2.4-BR]
Q190  AO3400A  [SOT-23-3_L2.9-W1.3-P1.90-LS2.4-BR]
Q191  AO3400A  [SOT-23-3_L2.9-W1.3-P1.90-LS2.4-BR]
Q192  AO3400A  [SOT-23-3_L2.9-W1.3-P1.90-LS2.4-BR]
Q193  AO3400A  [SOT-23-3_L2.9-W1.3-P1.90-LS2.4-BR]
Q194  AO3400A  [SOT-23-3_L2.9-W1.3-P1.90-LS2.4-BR]
Q195  AO3400A  [SOT-23-3_L2.9-W1.3-P1.90-LS2.4-BR]
R151  10K  [R0603]
R152  10K  [R0603]
R153  10K  [R0603]
R154  10K  [R0603]
R155  10K  [R0603]
R156  10R  [R0603]
R157  10R  [R0603]
R158  10R  [R0603]
R159  10K  [R0603]
R160  10K  [R0603]
R161  10R  [R0603]
R162  10K  [R0603]
R163  10R  [R0603]
R164  10K  [R0603]
R165  10K  [R0603]
R166  10K  [R0603]
R167  10K  [R0603]
R168  10K  [R0603]
R169  10K  [R0603]
R170  10K  [R0603]
R171  10R  [R0603]
R172  10K  [R0603]
R173  10R  [R0603]
R174  10R  [R0603]
R175  10K  [R0603]
R176  10R  [R0603]
R177  10K  [R0603]
R178  10R  [R0603]
R179  10K  [R0603]
R180  10K  [R0603]
R181  10K  [R0603]
R182  10K  [R0603]
R183  10K  [R0603]
R184  10K  [R0603]
R185  10K  [R0603]
R186  10R  [R0603]
R187  10K  [R0603]
R188  10R  [R0603]
R189  10R  [R0603]
R190  10K  [R0603]
R191  10R  [R0603]
R192  10R  [R0603]
R193  10K  [R0603]
R194  10K  [R0603]
R195  10K  [R0603]
sheet P10
Q196  AO3401A  [SOT-23_L2.9-W1.3-P1.90-LS2.4-BR]
Q197  AO3401A  [SOT-23_L2.9-W1.3-P1.90-LS2.4-BR]
Q198  AO3401A  [SOT-23_L2.9-W1.3-P1.90-LS2.4-BR]
Q199  AO3401A  [SOT-23_L2.9-W1.3-P1.90-LS2.4-BR]
Q200  AO3401A  [SOT-23_L2.9-W1.3-P1.90-LS2.4-BR]
Q201  AO3400A  [SOT-23-3_L2.9-W1.3-P1.90-LS2.4-BR]
Q202  AO3400A  [SOT-23-3_L2.9-W1.3-P1.90-LS2.4-BR]
Q203  AO3400A  [SOT-23-3_L2.9-W1.3-P1.90-LS2.4-BR]
Q204  AO3400A  [SOT-23-3_L2.9-W1.3-P1.90-LS2.4-BR]
Q205  AO3400A  [SOT-23-3_L2.9-W1.3-P1.90-LS2.4-BR]
Q206  AO3400A  [SOT-23-3_L2.9-W1.3-P1.90-LS2.4-BR]
Q207  AO3400A  [SOT-23-3_L2.9-W1.3-P1.90-LS2.4-BR]
Q208  AO3400A  [SOT-23-3_L2.9-W1.3-P1.90-LS2.4-BR]
Q209  AO3400A  [SOT-23-3_L2.9-W1.3-P1.90-LS2.4-BR]
Q210  AO3400A  [SOT-23-3_L2.9-W1.3-P1.90-LS2.4-BR]
Q211  AO3401A  [SOT-23_L2.9-W1.3-P1.90-LS2.4-BR]
Q212  AO3401A  [SOT-23_L2.9-W1.3-P1.90-LS2.4-BR]
Q213  AO3401A  [SOT-23_L2.9-W1.3-P1.90-LS2.4-BR]
Q214  AO3401A  [SOT-23_L2.9-W1.3-P1.90-LS2.4-BR]
Q215  AO3401A  [SOT-23_L2.9-W1.3-P1.90-LS2.4-BR]
Q216  AO3400A  [SOT-23-3_L2.9-W1.3-P1.90-LS2.4-BR]
Q217  AO3400A  [SOT-23-3_L2.9-W1.3-P1.90-LS2.4-BR]
Q218  AO3400A  [SOT-23-3_L2.9-W1.3-P1.90-LS2.4-BR]
Q219  AO3400A  [SOT-23-3_L2.9-W1.3-P1.90-LS2.4-BR]
Q220  AO3400A  [SOT-23-3_L2.9-W1.3-P1.90-LS2.4-BR]
Q221  AO3400A  [SOT-23-3_L2.9-W1.3-P1.90-LS2.4-BR]
Q222  AO3400A  [SOT-23-3_L2.9-W1.3-P1.90-LS2.4-BR]
Q223  AO3400A  [SOT-23-3_L2.9-W1.3-P1.90-LS2.4-BR]
Q224  AO3400A  [SOT-23-3_L2.9-W1.3-P1.90-LS2.4-BR]
Q225  AO3400A  [SOT-23-3_L2.9-W1.3-P1.90-LS2.4-BR]
Q226  AO3401A  [SOT-23_L2.9-W1.3-P1.90-LS2.4-BR]
Q227  AO3401A  [SOT-23_L2.9-W1.3-P1.90-LS2.4-BR]
Q228  AO3401A  [SOT-23_L2.9-W1.3-P1.90-LS2.4-BR]
Q229  AO3401A  [SOT-23_L2.9-W1.3-P1.90-LS2.4-BR]
Q230  AO3401A  [SOT-23_L2.9-W1.3-P1.90-LS2.4-BR]
Q231  AO3400A  [SOT-23-3_L2.9-W1.3-P1.90-LS2.4-BR]
Q232  AO3400A  [SOT-23-3_L2.9-W1.3-P1.90-LS2.4-BR]
Q233  AO3400A  [SOT-23-3_L2.9-W1.3-P1.90-LS2.4-BR]
Q234  AO3400A  [SOT-23-3_L2.9-W1.3-P1.90-LS2.4-BR]
Q235  AO3400A  [SOT-23-3_L2.9-W1.3-P1.90-LS2.4-BR]
Q236  AO3400A  [SOT-23-3_L2.9-W1.3-P1.90-LS2.4-BR]
Q237  AO3400A  [SOT-23-3_L2.9-W1.3-P1.90-LS2.4-BR]
Q238  AO3400A  [SOT-23-3_L2.9-W1.3-P1.90-LS2.4-BR]
Q239  AO3400A  [SOT-23-3_L2.9-W1.3-P1.90-LS2.4-BR]
Q240  AO3400A  [SOT-23-3_L2.9-W1.3-P1.90-LS2.4-BR]
R196  10K  [R0603]
R197  10K  [R0603]
R198  10K  [R0603]
R199  10K  [R0603]
R200  10K  [R0603]
R201  10R  [R0603]
R202  10R  [R0603]
R203  10R  [R0603]
R204  10K  [R0603]
R205  10K  [R0603]
R206  10R  [R0603]
R207  10K  [R0603]
R208  10R  [R0603]
R209  10K  [R0603]
R210  10K  [R0603]
R211  10K  [R0603]
R212  10K  [R0603]
R213  10K  [R0603]
R214  10K  [R0603]
R215  10K  [R0603]
R216  10R  [R0603]
R217  10K  [R0603]
R218  10R  [R0603]
R219  10R  [R0603]
R220  10K  [R0603]
R221  10R  [R0603]
R222  10K  [R0603]
R223  10R  [R0603]
R224  10K  [R0603]
R225  10K  [R0603]
R226  10K  [R0603]
R227  10K  [R0603]
R228  10K  [R0603]
R229  10K  [R0603]
R230  10K  [R0603]
R231  10R  [R0603]
R232  10K  [R0603]
R233  10R  [R0603]
R234  10R  [R0603]
R235  10K  [R0603]
R236  10R  [R0603]
R237  10R  [R0603]
R238  10K  [R0603]
R239  10K  [R0603]
R240  10K  [R0603]
sheet P11
C106  22uF  [C0805]
C107  1uF  [C0603]
C108  1uF  [C0603]
C109  22uF  [C0805]
C110  22uF  [C0805]
C111  1uF  [C0603]
C112  22uF  [C0805]
C113  22uF  [C0805]
D46  SS34  [SMA_L4.3-W2.5-LS5.0-RD]
DC1  DC-005-5A-2.0  [DC-IN-TH_DC-005-5A-2.0]
DC2  DC-012A-B200  [dc-in-th_dc-012a-b200]
LED1  -  [LED_0603]
LED2  -  [LED_0603]
LED3  -  [LED_0603]
Q241  AO3401A  [SOT-23_L2.9-W1.3-P1.90-LS2.4-BR]
Q242  AO3401A  [SOT-23_L2.9-W1.3-P1.90-LS2.4-BR]
Q243  AO3400A  [SOT-23-3_L2.9-W1.3-P1.90-LS2.4-BR]
Q244  AO3400A  [SOT-23-3_L2.9-W1.3-P1.90-LS2.4-BR]
R241  10K  [R0603]
R242  10R  [R0603]
R243  10K  [R0603]
R244  10K  [R0603]
R245  2K  [R0603]
R246  10K  [R0603]
R247  2K  [R0603]
R248  10K  [R0603]
R249  4.7K  [R0603]
R250  1K  [R0603]
R251  3.3K  [R0603]
R252  2K  [R0603]
R253  4.7K  [R0603]
R254  1K  [R0603]
R255  2K  [R0603]
R256  TDB  [R0603]
R257  1K  [R0603]
R258  10K  [R0603]
R259  10K  [R0603]
R260  10K  [R0603]
R261  10K  [R0603]
R262  10R  [R0603]
R263  10K  [R0603]
R264  10K  [R0603]
U106  TPS7B7702QPWPRQ1  [HTSSOP-16_L5.0-W4.4-P0.65-LS6.4-BL-EP]
U107  TPSPX3819M5-L-5-0  [SOT-23-5_L2.9-W1.6-P0.95-LS2.8-BR]
sheet P12
C114  100nF  [C0603]
C115  100nF  [C0603]
C116  100nF  [C0603]
C117  22uF  [C0805]
C118  100nF  [C0603]
C119  100nF  [C0603]
C120  100nF  [C0603]
C121  100nF  [C0603]
C122  100nF  [C0603]
C123  100nF  [C0603]
C124  10pF  [C0603]
C125  10pF  [C0603]
CN1  DB2EVC-2.5-2P-GN  [CONN-TH_2P-P2.50_DB2EVC-2.5-2P-GN]
CN2  DB2EVC-2.5-2P-GN  [CONN-TH_2P-P2.50_DB2EVC-2.5-2P-GN]
J1  PZ254V-11-04P  [HDR-TH_4P-P2.54-V-M]
R265  1k  [R0603]
R266  1k  [R0603]
R267  0  [R0603]
R268  0  [R0603]
R269  10K  [R0603]
R270  10K  [R0603]
R271  10K  [R0603]
R272  10K  [R0603]
R273  10K  [R0603]
R274  10K  [R0603]
R275  10K  [R0603]
R276  10K  [R0603]
R277  10K  [R0603]
R278  10K  [R0603]
R279  1M  [R0603]
U108  PY32F040R1BT6  [LQFP-64_L10.0-W10.0-P0.50-LS12.0-BL]
U109  TD301M485  [COMM-TH_TD301M485]
U110  M117  [DFN-6_L2.0-W2.0-P0.65-BL-EP1.2]
U111  M117  [DFN-6_L2.0-W2.0-P0.65-BL-EP1.2]
U112  M117  [DFN-6_L2.0-W2.0-P0.65-BL-EP1.2]
U113  M117  [DFN-6_L2.0-W2.0-P0.65-BL-EP1.2]
X1  8MHz  [CRYSTAL-SMD_4P-L3.2-W2.5-BL]

## Library data of the parts
C91-C105 C107 C108 C111 C114-C116 C118-C125 = CAP_0603: Supplier Footprint: 0603
Q91-Q105 Q111-Q120 Q126-Q135 Q141-Q150 Q156-Q165 Q171-Q180 Q186-Q195 Q201-Q210 Q216-Q225 Q231-Q240 Q243 Q244 = AO3400A_C20917: LCSC Part Name: 1个N沟道 耐压:30V 电流:5.7A; Supplier Part: C20917; Manufacturer: AOS; Supplier Footprint: SOT-23-3L; JLCPCB Part Class: 基础库; Datasheet: https://item.szlcsc.com/datasheet/AO3400A/21629.html; Supplier: LCSC; Drain to Source Voltage: 30V; RDS(on): 48mΩ@2.5V; Gate Threshold Voltage (Vgs(th)): 1.45V@250uA; Gate Charge(Qg): 7nC@10V; Input Capacitance(Ciss): 630pF@15V; Operating Temperature: -55℃~+150℃@(Tj); Type: N沟道
R91-R279 = Res_0603: Supplier Footprint: 0603
U91-U105 = WF100E 1BG S6 DA 0.5P4.5 AT: Supplier Part: C22388670; Manufacturer: WF(伟烽); Supplier Footprint: SOP-6; JLCPCB Part Class: 扩展库; Datasheet: https://item.szlcsc.com/datasheet/WF100E%25201BG%2520S6%2520DA%25200.5P4.5%2520AT/23957601.html; Supplier: LCSC; Pressure range: 0Kpa~1bar; Voltage - Supply: 5V; Operating Temperature: -40℃~+125℃
Q106-Q110 Q121-Q125 Q136-Q140 Q151-Q155 Q166-Q170 Q181-Q185 Q196-Q200 Q211-Q215 Q226-Q230 Q241 Q242 = AO3401A_C15127: LCSC Part Name: 1个P沟道 耐压:30V 电流:4A; Supplier Part: C15127; Manufacturer: AOS; Supplier Footprint: SOT-23; JLCPCB Part Class: 基础库; Datasheet: https://item.szlcsc.com/datasheet/AO3401A/15801.html; Supplier: LCSC; Number: 1个P沟道; Drain to Source Voltage: 30V; Current - Continuous Drain(Id): 4A; RDS(on): 47mΩ@10V；85mΩ@2.5V；60mΩ@4.5V; Gate Threshold Voltage (Vgs(th)): 900mV@250uA; Gate Charge(Qg): 14nC@10V; Input Capacitance(Ciss): 645pF; Reverse Transfer Capacitance (Crss@Vds): 55pF; Output Capacitance(Coss): 80pF
C106 C109 C110 C112 C113 C117 = CAP_0805: Supplier Footprint: 0805
D46 = SS34_C727060: 二极管配置:独立式;正向压降(Vf):550mV@3A;直流反向耐压(Vr):40V;平均整流电流(Io):3A;; LCSC Part Name: 电压:40V 电流:3A; Supplier Part: C727060; Manufacturer: TWGMC(台湾迪嘉); Supplier Footprint: SMA(DO-214AC); JLCPCB Part Class: Extended Part; Datasheet: https://atta.szlcsc.com/upload/public/pdf/source/20200828/C727059_6599B6CAC5F3238B9C33E46794659DBE.pdf; Supplier: LCSC; Diode Configuration: 独立式; Forward Voltage (Vf@If): 550mV@3A; Reverse Voltage (Vr): 40V; Average Rectified Current (Io): 3A; Reverse Leakage Current (Ir): 500uA@40V
DC1 = DC-005-5A-2.0: 连接器类型:DC电源插座;触点内径:2mm;触点外径:6.2mm;额定电流:5A;额定电压:24V;触头材质:黄铜;工作温度范围:-20℃~+70℃;焊接温度(最大值):260℃;; LCSC Part Name: DC电源插座 内径:2mm 外径:6.2mm; Supplier Part: C381116; Manufacturer: XKB Connectivity(中国星坤); Supplier Footprint: 插件; JLCPCB Part Class: Extended Part; Datasheet: https://atta.szlcsc.com/upload/public/pdf/source/20211015/707A35F7AB6E89C57AAB641950105BB7.pdf; Supplier: LCSC; Connector Type: DC电源插座; Inside Contact Diameter: 2mm; Outside Contact Diameter: 6.2mm; Current Rating (Max): 5A; Voltage Rating (Max): 24V; Operating Temperature Range: -20℃~+70℃; Contact Material: 黄铜; Welding Temperature (Max): 260℃
DC2 = DC-012A-B200: 连接器类型:DC电源插座;安装方式:直插;触点内径:2mm;触点外径:6.4mm;额定电流:2A;额定电压:30V;工作温度范围:-20℃~+70℃;; LCSC Part Name: DC电源插座 内径:2mm 外径:6.4mm; Supplier Part: C720563; Manufacturer: XUNPU(讯普); Supplier Footprint: 插件; JLCPCB Part Class: 扩展库; Datasheet: https://atta.szlcsc.com/upload/public/pdf/source/20240417/4D93A3C67534E4D912C478BF4A94DB25.pdf; Supplier: LCSC; Connector Type: DC电源插座; Mounting Style: 直插; Inside Contact Diameter: 2mm; Outside Contact Diameter: 6.4mm; Current Rating (Max): 2A; Voltage Rating (Max): 30V; Operating Temperature Range: -20℃~+70℃
LED1-LED3 = LED_0603-G: Supplier Footprint: 0603
U106 = TPS7B7702QPWPRQ1: 输出类型:可调;最大输入电压:40V;输出电压:1.5V~20V;输出电流:300mA;电源纹波抑制比(PSRR):73dB@(100Hz);; LCSC Part Name: 汽车类 300mA、电池供电运行 (40V)、双通道可调节天线低压降稳压器; Supplier Part: C575546; Manufacturer: TI(德州仪器); Supplier Footprint: HTSSOP-16-EP; JLCPCB Part Class: 扩展库; Datasheet: https://www.ti.com/cn/lit/gpn/tps7b7702-q1; Supplier: LCSC; Output Type: 可调; Maximum Input Voltage: 40V; Output Voltage: 1.5V~20V; Output Current: 300mA; Power Supply Rejection Ratio (PSRR): 73dB@(100Hz); Operating Temperature: -40℃~+150℃@(Tj)
U107 = TPSPX3819M5-L-5-0: LCSC Part Name: 20V、500mA、5μA，高电源抑制比电压调节器; Supplier Part: C5370987; Manufacturer: TECH PUBLIC(台舟); Supplier Footprint: SOT-23-5; JLCPCB Part Class: 扩展库; Datasheet: https://item.szlcsc.com/datasheet/TPSPX3819M5-L-5-0/6218024.html; Supplier: LCSC; Output Type: 固定; Voltage - Supply: 20V; Output Voltage: 5V; Output Current: 500mA; Power Supply Rejection Ratio (PSRR): 70dB@(1kHz); Voltage Dropout: 350mV@(100mA); standby current: 5uA; Features: 带使能；过流保护；过热保护; Operating Temperature: -40℃~+85℃@(Ta); Output Configuration: 正极; Number of Outputs: 1
CN1 CN2 = DB2EVC-2.5-2P-GN: 连接器类型:板端/插座-闭口;结构:1x2P;间距:2.5mm;颜色:绿色;安装方式:直针;排数:1;每排PIN数:2;额定电流:5A;额定电压:150V;工作温度:-40℃~+105℃;; LCSC Part Name: 2.5mm 1x2P 排数:1 每排P数:2; Supplier Part: C2924411; Manufacturer: DORABO(地博电气); Supplier Footprint: 插件,P=2.5mm; JLCPCB Part Class: 扩展库; Datasheet: https://atta.szlcsc.com/upload/public/pdf/source/20230321/C1039C1DACA390651A0DC069860749DA.pdf; Supplier: LCSC; Connector Type: 板端/插座-闭口; Number of Positions or Pins: 1x2P; Pitch: 2.5mm; Color: 绿色; Mounting Type: 直针; Number of Pins: 2P; Number of Rows: 1; Number of PINs Per Row: 2; Current Rating: 5A; Voltage Rating (Max): 150V; Operating Temperature: -40℃~+105℃
J1 = PZ254V-11-04P: 插针结构:1x4P;间距:2.54mm;行距:-;圆针/方针:方针;安装类型:直插;排数:单排;总PIN位数:4P;额定电流:3A;额定电压:250V;配合针长度:6mm;塑高:2.5mm;端接针长度:3mm;触头材质:-;工作温度范围:-40℃~+105℃;颜色:黑色;; LCSC Part Name: 间距:2.54mm 1x4P 直插 方针; Supplier Part: C2691448; Manufacturer: XFCN(兴飞); Supplier Footprint: 插件,P=2.54mm; JLCPCB Part Class: 扩展库; Datasheet: https://atta.szlcsc.com/upload/public/pdf/source/20200309/C492403_F9F19131791D08044AD4F84F8E751A34.pdf; Supplier: LCSC; Pin Structure: 1x4P; Pitch: 2.54mm; Circluar Pins/Square Pins: 方针; Mounting Type: 直插; Number of Rows: 单排; Number of Pins: 4P; Current Rating (Max): 3A; Voltage Rating (Max): 250V; Length of Mating Pin: 6mm; Insulation Height: 2.5mm; Length of End Connection Pin: 3mm; Operating Temperature Range: -40℃~+105℃; Color: 黑色
U108 = PY32F040R1BT6_C20416702: Supplier Part: C20416702; Manufacturer: PUYA(普冉); Supplier Footprint: LQFP-64(10x10); JLCPCB Part Class: 扩展库; Datasheet: https://item.szlcsc.com/datasheet/PY32F040R1BT6/21750557.html; Supplier: LCSC
U109 = TD301M485: 数据速率:500Kbps;节点数:64;自动流控:是;; LCSC Part Name: 500Kbps 64; Supplier Part: C2682606; Manufacturer: VISOM; Supplier Footprint: DIP-8; JLCPCB Part Class: 扩展库; Datasheet: https://atta.szlcsc.com/upload/public/pdf/source/20210105/C2682606_F1AD21272F430052E64FB3724D643821.pdf; Supplier: LCSC; Data Rate: 500Kbps; ESD Protect: 是; Supply Voltage: 3.15V~3.45V; isolation: 2500V; Node Number: 64; Quiescent Current: 22mA; Automatic flow control: 是; Operating Temperature: -40℃~+85℃
U110-U113 = M117_C2843548: 温度范围:-70℃~+150℃;精度:±0.1℃;接口类型:I2C;; LCSC Part Name: 0.1℃ I2C数字温度传感器; Supplier Part: C2843548; Manufacturer: Mysentech(敏源传感); Supplier Footprint: DFN-6-EP(2x2); JLCPCB Part Class: 扩展库; Datasheet: https://atta.szlcsc.com/upload/public/pdf/source/20210825/E4930D3FBCA70456AA9027E524284463.pdf; Supplier: LCSC; Temperature Range: -70℃~+150℃; Tolerance: ±0.1℃; Voltage - Supply: 1.8V~5.5V; Standby Current: 100nA; Interface: I2C
X1 = TAXM8M4RDBCCT2T: 晶振类型:贴片晶振;频率:8MHz;常温频差:±10ppm;负载电容:10pF;频率稳定度(全温):±15ppm;; LCSC Part Name: 8MHz ±10ppm 10pF; Supplier Part: C400090; Manufacturer: YJX(雅晶鑫); Supplier Footprint: SMD3225-4P; JLCPCB Part Class: 扩展库; Datasheet: https://atta.szlcsc.com/upload/public/pdf/source/20190626/C400090_CF95B89E745AFE4EF2E392EF8AC009D6.pdf; Supplier: LCSC; Crystal Type: 贴片晶振; Normal temperature Frequency Tolerance: ±10ppm; Load Capacitor: 10pF; Frequency Stability(Full temperature range): ±15ppm; Equivalent Series Resistance (ESR): 250Ω; Operating Temperature: -40℃~+85℃

## Nets
+7.5V: C110.2 Q196.2(S) Q197.2(S) Q198.2(S) Q199.2(S) Q200.2(S) Q211.2(S) Q212.2(S) Q213.2(S) Q214.2(S) Q215.2(S) Q226.2(S) Q227.2(S) Q228.2(S) Q229.2(S) Q230.2(S) Q242.2(S) R196.2 R197.2 R198.2 R199.2 R200.2 R211.2 R212.2 R213.2 R214.2 R215.2 R226.2 R227.2 R228.2 R229.2 R230.2 R246.2 R247.1 R260.2 U106.14(OUT2)
GND: C91.1 C92.1 C93.1 C94.1 C95.1 C96.1 C97.1 C98.1 C99.1 C100.1 C101.1 C102.1 C103.1 C104.1 C105.1 C106.2 C107.1 C108.1 C109.1 C110.1 C111.1 C112.1 C113.1 C114.2 C115.1 C116.1 C117.2 C118.1 C119.1 C120.1 C121.1 C122.1 C123.1 C124.2 C125.1 DC1.2 DC1.3 DC2.2 DC2.3 J1.2 LED1.1(C) LED2.1(C) Q111.2(S) Q112.2(S) Q113.2(S) Q114.2(S) Q115.2(S) Q116.2(S) Q117.2(S) Q118.2(S) Q119.2(S) Q120.2(S) Q126.2(S) Q127.2(S) Q128.2(S) Q129.2(S) Q130.2(S) Q131.2(S) Q132.2(S) Q133.2(S) Q134.2(S) Q135.2(S) Q141.2(S) Q142.2(S) Q143.2(S) Q144.2(S) Q145.2(S) Q146.2(S) Q147.2(S) Q148.2(S) Q149.2(S) Q150.2(S) Q156.2(S) Q157.2(S) Q158.2(S) Q159.2(S) Q160.2(S) Q161.2(S) Q162.2(S) Q163.2(S) Q164.2(S) Q165.2(S) Q171.2(S) Q172.2(S) Q173.2(S) Q174.2(S) Q175.2(S) Q176.2(S) Q177.2(S) Q178.2(S) Q179.2(S) Q180.2(S) Q186.2(S) Q187.2(S) Q188.2(S) Q189.2(S) Q190.2(S) Q191.2(S) Q192.2(S) Q193.2(S) Q194.2(S) Q195.2(S) Q201.2(S) Q202.2(S) Q203.2(S) Q204.2(S) Q205.2(S) Q206.2(S) Q207.2(S) Q208.2(S) Q209.2(S) Q210.2(S) Q216.2(S) Q217.2(S) Q218.2(S) Q219.2(S) Q220.2(S) Q221.2(S) Q222.2(S) Q223.2(S) Q224.2(S) Q225.2(S) Q231.2(S) Q232.2(S) Q233.2(S) Q234.2(S) Q235.2(S) Q236.2(S) Q237.2(S) Q238.2(S) Q239.2(S) Q240.2(S) Q243.2(S) Q244.2(S) R114.1 R115.1 R117.1 R119.1 R120.1 R127.1 R130.1 R132.1 R134.1 R135.1 R142.1 R145.1 R148.1 R149.1 R150.1 R159.1 R160.1 R162.1 R164.1 R165.1 R172.1 R175.1 R177.1 R179.1 R180.1 R187.1 R190.1 R193.1 R194.1 R195.1 R204.1 R205.1 R207.1 R209.1 R210.1 R217.1 R220.1 R222.1 R224.1 R225.1 R232.1 R235.1 R238.1 R239.1 R240.1 R248.1 R249.1 R250.2 R252.1 R253.1 R254.2 R256.1 R257.2 R259.1 R263.1 R264.1 R270.1 U91.1(GND) U92.1(GND) U93.1(GND) U94.1(GND) U95.1(GND) U96.1(GND) U97.1(GND) U98.1(GND) U99.1(GND) U100.1(GND) U101.1(GND) U102.1(GND) U103.1(GND) U104.1(GND) U105.1(GND) U106.12(GND) U106.17(GND) U107.2(GND) U108.12(VSSA) U108.31(VSS) U108.63(VSS) U109.3(GND) U110.2(GND) U110.7(EP) U111.2(GND) U111.7(EP) U112.2(GND) U112.7(EP) U113.2(GND) U113.7(EP) X1.2 X1.4 ; also on sheet 1 2 3 4 5 6
V75_FB: R246.1 R252.2 U106.13(FB2)
VCC: C113.2 C114.1 C115.2 C117.1 C118.2 C119.2 C120.2 C121.2 C122.2 C123.2 J1.1 R269.2 R271.2 R272.2 R273.2 R274.2 R275.2 R276.2 R277.2 R278.2 U107.5(VOUT) U108.13(VCCA) U108.32(VCC) U108.64(VCC) U109.4(VCC) U110.4(NC) U110.5(VDD) U111.4(NC) U111.5(VDD) U112.4(NC) U112.5(VDD) U113.4(NC) U113.5(VDD)
VCC_1: C107.2 R255.1 U106.4(VCC)
VDD: C109.2 Q106.2(S) Q107.2(S) Q108.2(S) Q109.2(S) Q110.2(S) Q121.2(S) Q122.2(S) Q123.2(S) Q124.2(S) Q125.2(S) Q136.2(S) Q137.2(S) Q138.2(S) Q139.2(S) Q140.2(S) R106.2 R107.2 R108.2 R109.2 R110.2 R121.2 R122.2 R123.2 R124.2 R125.2 R136.2 R137.2 R138.2 R139.2 R140.2 R244.2 R245.1 R258.2 U106.16(OUT1)
VDD1: Q106.3(D) Q113.3(D) R91.1 ; also on sheet 1 2 3 4 5 6
VDD1_EN: R111.1 R156.1 R201.1 U108.59(PB7)
VDD2: Q107.3(D) Q114.3(D) R92.1 ; also on sheet 1 2 3 4 5 6
VDD2_EN: R112.1 R157.1 R202.1 U108.58(PB6)
VDD3: Q108.3(D) Q116.3(D) R93.1 ; also on sheet 1 2 3 4 5 6
VDD3_EN: R113.1 R158.1 R203.1 U108.57(PB5)
VDD4: Q109.3(D) Q118.3(D) R94.1 ; also on sheet 1 2 3 4 5 6
VDD4_EN: R116.1 R161.1 R206.1 U108.56(PB4)
VDD5: Q110.3(D) Q120.3(D) R95.1 ; also on sheet 1 2 3 4 5 6
VDD5_EN: R118.1 R163.1 R208.1 U108.55(PB3)
VDD6: Q121.3(D) Q127.3(D) R96.1 ; also on sheet 1 2 3 4 5 6
VDD6_EN: R126.1 R171.1 R216.1 U108.54(PF7)
VDD7: Q122.3(D) Q129.3(D) R97.1 ; also on sheet 1 2 3 4 5 6
VDD7_EN: R128.1 R173.1 R218.1 U108.53(PC12)
VDD8: Q123.3(D) Q131.3(D) R98.1 ; also on sheet 1 2 3 4 5 6
VDD8_EN: R129.1 R174.1 R219.1 U108.52(PC11)
VDD9: Q124.3(D) Q133.3(D) R99.1 ; also on sheet 1 2 3 4 5 6
VDD9_EN: R131.1 R176.1 R221.1 U108.51(PC10)
VDD10: Q125.3(D) Q135.3(D) R100.1 ; also on sheet 1 2 3 4 5 6
VDD10_EN: R133.1 R178.1 R223.1 U108.50(PA15)
VDD11: Q136.3(D) Q142.3(D) R101.1 ; also on sheet 1 2 3 4 5 6
VDD11_EN: R141.1 R186.1 R231.1 U108.45(PA12)
VDD12: Q137.3(D) Q145.3(D) R102.1 ; also on sheet 1 2 3 4 5 6
VDD12_EN: R143.1 R188.1 R233.1 U108.44(PA11)
VDD13: Q138.3(D) Q146.3(D) R103.1 ; also on sheet 1 2 3 4 5 6
VDD13_EN: R144.1 R189.1 R234.1 U108.43(PA10)
VDD14: Q139.3(D) Q148.3(D) R104.1 ; also on sheet 1 2 3 4 5 6
VDD14_EN: R146.1 R191.1 R236.1 U108.42(PA9)
VDD15: Q140.3(D) Q150.3(D) R105.1 ; also on sheet 1 2 3 4 5 6
VDD15_EN: R147.1 R192.1 R237.1 U108.41(PA8)
VDD_ADC: R258.1 R259.2 U108.24(PC4)
VDD_EN: U106.2(EN1) U106.3(EN2) U108.2(PC13)
VDD_FB: R244.1 R251.2 U106.15(FB1)
ADC: R243.1 R248.2 U108.14(PA0)
DC12V: C112.2 D46.1(C) Q241.2(S) R241.2 R243.2 U107.1(VIN) U107.3(EN)
OUT1: U108.15(PA1) ; also on sheet 1
OUT1_EN: Q91.1(G) Q196.3(D) Q203.3(D) ; also on sheet 1 2 3 4 5 6
OUT2: U108.16(PA2) ; also on sheet 2
OUT2_EN: Q92.1(G) Q197.3(D) Q204.3(D) ; also on sheet 1 2 3 4 5 6
OUT3: U108.17(PA3) ; also on sheet 3
OUT3_EN: Q93.1(G) Q198.3(D) Q206.3(D) ; also on sheet 1 2 3 4 5 6
OUT4: U108.20(PA4) ; also on sheet 4
OUT4_EN: Q94.1(G) Q199.3(D) Q208.3(D) ; also on sheet 1 2 3 4 5 6
OUT5: U108.21(PA5) ; also on sheet 5
OUT5_EN: Q95.1(G) Q200.3(D) Q210.3(D) ; also on sheet 1 2 3 4 5 6
OUT6: U108.22(PA6) ; also on sheet 6
OUT6_EN: Q96.1(G) Q211.3(D) Q217.3(D) ; also on sheet 1 2 3 4 5 6
OUT7: Q91.3(D) Q92.3(D) Q93.3(D) Q94.3(D) Q95.3(D) Q96.3(D) Q97.3(D) Q98.3(D) Q99.3(D) Q100.3(D) Q101.3(D) Q102.3(D) Q103.3(D) Q104.3(D) Q105.3(D) U108.23(PA7)
OUT7_EN: Q97.1(G) Q212.3(D) Q219.3(D) ; also on sheet 1 2 3 4 5 6
OUT8_EN: Q98.1(G) Q213.3(D) Q221.3(D) ; also on sheet 1 2 3 4 5 6
OUT9_EN: Q99.1(G) Q214.3(D) Q223.3(D) ; also on sheet 1 2 3 4 5 6
OUT10_EN: Q100.1(G) Q215.3(D) Q225.3(D) ; also on sheet 1 2 3 4 5 6
OUT11_EN: Q101.1(G) Q226.3(D) Q232.3(D) ; also on sheet 1 2 3 4 5 6
OUT12_EN: Q102.1(G) Q227.3(D) Q235.3(D) ; also on sheet 1 2 3 4 5 6
OUT13_EN: Q103.1(G) Q228.3(D) Q236.3(D) ; also on sheet 1 2 3 4 5 6
OUT14_EN: Q104.1(G) Q229.3(D) Q238.3(D) ; also on sheet 1 2 3 4 5 6
OUT15_EN: Q105.1(G) Q230.3(D) Q240.3(D) ; also on sheet 1 2 3 4 5 6
PROTECT: R242.2 U108.1(PF9)
RX_MCU: R265.2 U108.30(PB11)
SCL_1: R271.1 U108.40(PC9) U110.1(SCL)
SCL_2: R272.1 U108.38(PC7) U111.1(SCL)
SCL_3: R273.1 U108.36(PB15) U112.1(SCL)
SCL_4: R274.1 U108.34(PB13) U113.1(SCL)
SDA_1: R275.1 U108.39(PC8) U110.6(SDA)
SDA_2: R276.1 U108.37(PC6) U111.6(SDA)
SDA_3: R277.1 U108.35(PB14) U112.6(SDA)
SDA_4: R278.1 U108.33(PB12) U113.6(SDA)
SWCLK: J1.4 U108.49(PA14-SWC)
SWDIO: J1.3 U108.46(PA13-SWD)
TX_MCU: R266.2 U108.29(PB10)
VPP: Q151.2(S) Q152.2(S) Q153.2(S) Q154.2(S) Q155.2(S) Q166.2(S) Q167.2(S) Q168.2(S) Q169.2(S) Q170.2(S) Q181.2(S) Q182.2(S) Q183.2(S) Q184.2(S) Q185.2(S) Q242.3(D) Q244.3(D) R151.2 R152.2 R153.2 R154.2 R155.2 R166.2 R167.2 R168.2 R169.2 R170.2 R181.2 R182.2 R183.2 R184.2 R185.2 R261.2
VPP1: Q151.3(D) Q158.3(D) U91.4(NC) ; also on sheet 1 2 3 4 5 6
VPP2: Q152.3(D) Q159.3(D) U92.4(NC) ; also on sheet 1 2 3 4 5 6
VPP3: Q153.3(D) Q161.3(D) U93.4(NC) ; also on sheet 1 2 3 4 5 6
VPP4: Q154.3(D) Q163.3(D) U94.4(NC) ; also on sheet 1 2 3 4 5 6
VPP5: Q155.3(D) Q165.3(D) U95.4(NC) ; also on sheet 1 2 3 4 5 6
VPP6: Q166.3(D) Q172.3(D) U96.4(NC) ; also on sheet 1 2 3 4 5 6
VPP7: Q167.3(D) Q174.3(D) U97.4(NC) ; also on sheet 1 2 3 4 5 6
VPP8: Q168.3(D) Q176.3(D) U98.4(NC) ; also on sheet 1 2 3 4 5 6
VPP9: Q169.3(D) Q178.3(D) U99.4(NC) ; also on sheet 1 2 3 4 5 6
VPP10: Q170.3(D) Q180.3(D) U100.4(NC) ; also on sheet 1 2 3 4 5 6
VPP11: Q181.3(D) Q187.3(D) U101.4(NC) ; also on sheet 1 2 3 4 5 6
VPP12: Q182.3(D) Q190.3(D) U102.4(NC) ; also on sheet 1 2 3 4 5 6
VPP13: Q183.3(D) Q191.3(D) U103.4(NC) ; also on sheet 1 2 3 4 5 6
VPP14: Q184.3(D) Q193.3(D) U104.4(NC) ; also on sheet 1 2 3 4 5 6
VPP15: Q185.3(D) Q195.3(D) U105.4(NC) ; also on sheet 1 2 3 4 5 6
VPP_ADC: R261.1 R263.2 U108.25(PC5)
VPP_EN: R262.1 U108.3(PC14-OSC32_IN)
XIN: C124.1 R279.2 U108.5(PF0-OSC_IN) X1.1
XOUT: C125.2 R279.1 U108.6(PF1-OSC_OUT) X1.3
$7N13570: C91.2 R91.2 U91.3(VDD)
$7N13576: Q91.2(S) U91.2(SO)
$7N13582: C92.2 R92.2 U92.3(VDD)
$7N13588: Q92.2(S) U92.2(SO)
$7N13594: C93.2 R93.2 U93.3(VDD)
$7N13600: Q93.2(S) U93.2(SO)
$7N13606: C94.2 R94.2 U94.3(VDD)
$7N13612: Q94.2(S) U94.2(SO)
$7N13618: C95.2 R95.2 U95.3(VDD)
$7N13624: Q95.2(S) U95.2(SO)
$7N13630: C96.2 R96.2 U96.3(VDD)
$7N13636: Q96.2(S) U96.2(SO)
$7N13642: C97.2 R97.2 U97.3(VDD)
$7N13648: Q97.2(S) U97.2(SO)
$7N13654: C98.2 R98.2 U98.3(VDD)
$7N13660: Q98.2(S) U98.2(SO)
$7N13666: C99.2 R99.2 U99.3(VDD)
$7N13672: Q99.2(S) U99.2(SO)
$7N13678: C100.2 R100.2 U100.3(VDD)
$7N13684: Q100.2(S) U100.2(SO)
$7N13690: C101.2 R101.2 U101.3(VDD)
$7N13696: Q101.2(S) U101.2(SO)
$7N13702: C102.2 R102.2 U102.3(VDD)
$7N13708: Q102.2(S) U102.2(SO)
$7N13714: C103.2 R103.2 U103.3(VDD)
$7N13720: Q103.2(S) U103.2(SO)
$7N13726: C104.2 R104.2 U104.3(VDD)
$7N13732: Q104.2(S) U104.2(SO)
$7N13738: C105.2 R105.2 U105.3(VDD)
$7N13744: Q105.2(S) U105.2(SO)
$8N2294: R267.2 U109.7(B)
$8N2295: R268.2 U109.6(A)
$8N2302: CN1.2 CN2.2 R267.1
$8N2303: CN1.1 CN2.1 R268.1
$8N2312: C116.2 R269.1 U108.7(PF2-NRST)
$8N2323: R270.2 U108.60(PF8-BOOT0)
$8N2338: R265.1 U109.1(RXD)
$8N2339: R266.1 U109.2(TXD)
$9N1038: LED2.2(A) R247.2
$9N1039: LED1.2(A) R245.2
$9N1049: R257.1 U106.7(SENSE_SEL) U106.8(SENSE_EN#)
$9N1056: LED3.2(A) R255.2
$9N1057: LED3.1(C) U106.9(ERR#)
$9N1060: R250.1 U106.11(LIM2)
$9N1061: R254.1 U106.10(LIM1)
$9N1067: C111.2 R253.2 U106.6(SENSE2)
$9N1069: C108.2 R249.2 U106.5(SENSE1)
$9N1073: C106.1 Q241.3(D) U106.1(IN)
$9N2396: D46.2(A) DC1.1 DC2.1
$9N3170: R251.1 R256.2
$9N4574: Q242.1(G) Q243.3(D) Q244.1(G) R260.1
$9N4576: Q243.1(G) R262.2 R264.2
$9N7911: Q241.1(G) R241.1 R242.1
$10N316: Q106.1(G) Q111.3(D) Q113.1(G) R106.1
$10N319: Q111.1(G) R111.2 R114.2
$10N1487: Q107.1(G) Q112.3(D) Q114.1(G) R107.1
$10N1490: Q112.1(G) R112.2 R115.2
$10N1744: Q108.1(G) Q115.3(D) Q116.1(G) R108.1
$10N1747: Q115.1(G) R113.2 R119.2
$10N2001: Q109.1(G) Q117.3(D) Q118.1(G) R109.1
$10N2004: Q117.1(G) R116.2 R117.2
$10N2258: Q110.1(G) Q119.3(D) Q120.1(G) R110.1
$10N2261: Q119.1(G) R118.2 R120.2
$10N3505: Q121.1(G) Q126.3(D) Q127.1(G) R121.1
$10N3508: Q126.1(G) R126.2 R127.2
$10N3513: Q122.1(G) Q128.3(D) Q129.1(G) R122.1
$10N3516: Q128.1(G) R128.2 R130.2
$10N3521: Q123.1(G) Q130.3(D) Q131.1(G) R123.1
$10N3524: Q130.1(G) R129.2 R134.2
$10N3529: Q124.1(G) Q132.3(D) Q133.1(G) R124.1
$10N3532: Q132.1(G) R131.2 R132.2
$10N3537: Q125.1(G) Q134.3(D) Q135.1(G) R125.1
$10N3540: Q134.1(G) R133.2 R135.2
$10N4790: Q136.1(G) Q141.3(D) Q142.1(G) R136.1
$10N4793: Q141.1(G) R141.2 R142.2
$10N4798: Q137.1(G) Q143.3(D) Q145.1(G) R137.1
$10N4801: Q143.1(G) R143.2 R145.2
$10N4806: Q138.1(G) Q144.3(D) Q146.1(G) R138.1
$10N4809: Q144.1(G) R144.2 R148.2
$10N4814: Q139.1(G) Q147.3(D) Q148.1(G) R139.1
$10N4817: Q147.1(G) R146.2 R149.2
$10N4822: Q140.1(G) Q149.3(D) Q150.1(G) R140.1
$10N4825: Q149.1(G) R147.2 R150.2
$11N563: Q151.1(G) Q156.3(D) Q158.1(G) R151.1
$11N566: Q156.1(G) R156.2 R159.2
$11N830: Q152.1(G) Q157.3(D) Q159.1(G) R152.1
$11N833: Q157.1(G) R157.2 R160.2
$11N1334: Q153.1(G) Q160.3(D) Q161.1(G) R153.1
$11N1337: Q160.1(G) R158.2 R164.2
$11N1342: Q154.1(G) Q162.3(D) Q163.1(G) R154.1
$11N1345: Q162.1(G) R161.2 R162.2
$11N2110: Q155.1(G) Q164.3(D) Q165.1(G) R155.1
$11N2111: Q164.1(G) R163.2 R165.2
$11N3356: Q166.1(G) Q171.3(D) Q172.1(G) R166.1
$11N3359: Q171.1(G) R171.2 R172.2
$11N3364: Q167.1(G) Q173.3(D) Q174.1(G) R167.1
$11N3367: Q173.1(G) R173.2 R175.2
$11N3372: Q168.1(G) Q175.3(D) Q176.1(G) R168.1
$11N3375: Q175.1(G) R174.2 R179.2
$11N3380: Q169.1(G) Q177.3(D) Q178.1(G) R169.1
$11N3383: Q177.1(G) R176.2 R177.2
$11N3388: Q170.1(G) Q179.3(D) Q180.1(G) R170.1
$11N3391: Q179.1(G) R178.2 R180.2
$11N4641: Q181.1(G) Q186.3(D) Q187.1(G) R181.1
$11N4644: Q186.1(G) R186.2 R187.2
$11N4649: Q182.1(G) Q188.3(D) Q190.1(G) R182.1
$11N4652: Q188.1(G) R188.2 R190.2
$11N4657: Q183.1(G) Q189.3(D) Q191.1(G) R183.1
$11N4660: Q189.1(G) R189.2 R193.2
$11N4665: Q184.1(G) Q192.3(D) Q193.1(G) R184.1
$11N4668: Q192.1(G) R191.2 R194.2
$11N4673: Q185.1(G) Q194.3(D) Q195.1(G) R185.1
$11N4676: Q194.1(G) R192.2 R195.2
$12N319: Q196.1(G) Q201.3(D) Q203.1(G) R196.1
$12N321: Q201.1(G) R201.2 R204.2
$12N576: Q197.1(G) Q202.3(D) Q204.1(G) R197.1
$12N578: Q202.1(G) R202.2 R205.2
$12N1080: Q198.1(G) Q205.3(D) Q206.1(G) R198.1
$12N1082: Q205.1(G) R203.2 R209.2
$12N1088: Q199.1(G) Q207.3(D) Q208.1(G) R199.1
$12N1090: Q207.1(G) R206.2 R207.2
$12N1342: Q209.1(G) R208.2 R210.2
$12N1349: Q200.1(G) Q209.3(D) Q210.1(G) R200.1
$12N2592: Q211.1(G) Q216.3(D) Q217.1(G) R211.1
$12N2594: Q216.1(G) R216.2 R217.2
$12N2600: Q212.1(G) Q218.3(D) Q219.1(G) R212.1
$12N2602: Q218.1(G) R218.2 R220.2
$12N2608: Q213.1(G) Q220.3(D) Q221.1(G) R213.1
$12N2610: Q220.1(G) R219.2 R224.2
$12N2616: Q214.1(G) Q222.3(D) Q223.1(G) R214.1
$12N2618: Q222.1(G) R221.2 R222.2
$12N2624: Q215.1(G) Q224.3(D) Q225.1(G) R215.1
$12N2626: Q224.1(G) R223.2 R225.2
$12N3877: Q226.1(G) Q231.3(D) Q232.1(G) R226.1
$12N3879: Q231.1(G) R231.2 R232.2
$12N3885: Q227.1(G) Q233.3(D) Q235.1(G) R227.1
$12N3887: Q233.1(G) R233.2 R235.2
$12N3893: Q228.1(G) Q234.3(D) Q236.1(G) R228.1
$12N3895: Q234.1(G) R234.2 R238.2
$12N3901: Q229.1(G) Q237.3(D) Q238.1(G) R229.1
$12N3903: Q237.1(G) R236.2 R239.2
$12N3909: Q230.1(G) Q239.3(D) Q240.1(G) R230.1
$12N3911: Q239.1(G) R237.2 R240.2

Not connected (* = marked no-connect by the designer): U91 5(NC)* 6(NC)*; U92 5(NC)* 6(NC)*; U93 5(NC)* 6(NC)*; U94 5(NC)* 6(NC)*; U95 5(NC)* 6(NC)*; U96 5(NC)* 6(NC)*; U97 5(NC)* 6(NC)*; U98 5(NC)* 6(NC)*; U99 5(NC)* 6(NC)*; U100 5(NC)* 6(NC)*; U101 5(NC)* 6(NC)*; U102 5(NC)* 6(NC)*; U103 5(NC)* 6(NC)*; U104 5(NC)* 6(NC)*; U105 5(NC)* 6(NC)*; U107 4(NC)*; U108 4(PC15-OSC32_OUT)* 8(PC0)* 9(PC1)* 10(PC2)* 11(PC3)* 18(PF3)* 19(PF4)* 26(PB0)* 27(PB1)* 28(PB2)* 47(PF5)* 48(PF6)* 61(PB8)* 62(PB9)*; U109 5(RGND)* 8(VO)*; U110 3(ALERT)*; U111 3(ALERT)*; U112 3(ALERT)*; U113 3(ALERT)*
